# Altium project Thunderscope_Rev5.3.PrjPcb (part 2 of 3)

## Sheet FPGA_Bank_IO.SchDoc
size 297 x 209 mm
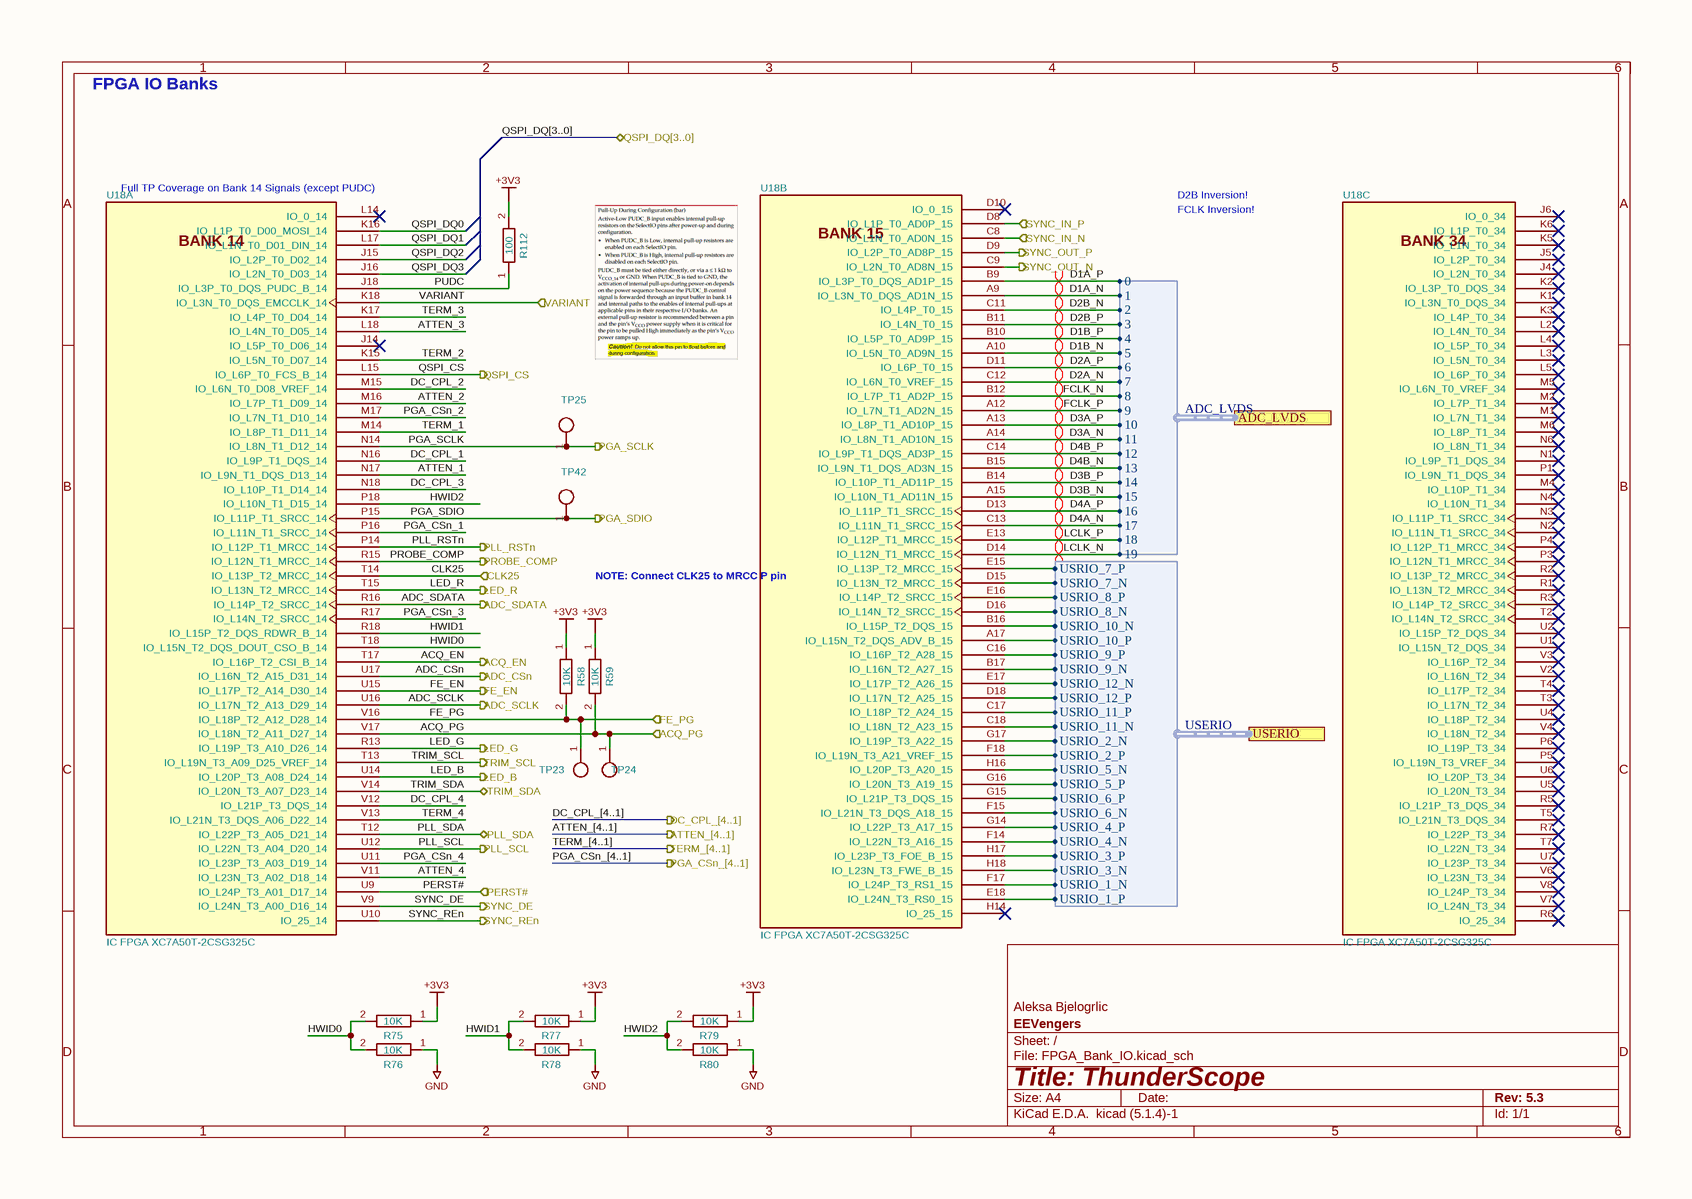
[diagram p5: FPGA_Bank_IO.SchDoc]

### Parts
R58  10K  [GEN_R_0402]
R59  10K  [GEN_R_0402]
R75  10K  [GEN_R_0402]
R76  10K  [GEN_R_0402]
R77  10K  [GEN_R_0402]
R78  10K  [GEN_R_0402]
R79  10K  [GEN_R_0402]
R80  10K  [GEN_R_0402]
R112  100  [GEN_R_0402]
TP23  PCB  [GEN_TP_PCB]  (value not drawn)
TP24  PCB  [GEN_TP_PCB]  (value not drawn)
TP25  PCB  [GEN_TP_PCB]  (value not drawn)
TP42  PCB  [GEN_TP_PCB]  (value not drawn)
U18  IC FPGA XC7A50T-2CSG325C  [XILINX_XC7A50T-2CSG325C]  (parts A,B,C of 9)

### Ports
ACQ_EN (out), ACQ_PG (in), ADC_CSn (out), ADC_LVDS (harness ADC_LVDS), ADC_SCLK (out), ADC_SDATA (out), ATTEN_[4..1] (out), CLK25 (in), DC_CPL_[4..1] (out), FE_EN (out), FE_PG (in), LED_B (out), LED_G (out), LED_R (out), PERST# (in), PGA_CSn_[4..1] (out), PGA_SCLK (out), PGA_SDIO (out), PLL_RSTn (out), PLL_SCL (out), PLL_SDA (bidir), PROBE_COMP (out), QSPI_CS (out), QSPI_DQ[3..0] (bidir), SYNC_DE (out), SYNC_IN_N (in), SYNC_IN_P (in), SYNC_OUT_N (out), SYNC_OUT_P (out), SYNC_REn (out), TERM_[4..1] (out), TRIM_SCL (out), TRIM_SDA (bidir), USERIO (harness USERIO), VARIANT (in)

### Harnesses
USERIO: USRIO_1_P, USRIO_1_N, USRIO_2_P, USRIO_2_N, USRIO_3_P, USRIO_3_N, USRIO_4_P, USRIO_4_N, USRIO_5_P, USRIO_5_N, USRIO_6_P, USRIO_6_N, USRIO_7_P, USRIO_7_N, USRIO_8_P, USRIO_8_N, USRIO_9_P, USRIO_9_N, USRIO_10_P, USRIO_10_N, USRIO_11_P, USRIO_11_N, USRIO_12_P, USRIO_12_N
ADC_LVDS: 0, 1, 2, 3, 4, 5, 6, 7, 8, 9, 10, 11, 12, 13, 14, 15, 16, 17, 18, 19

### Nets
+3V3: R58.1 R59.1 R75.1 R77.1 R79.1 R112.2
GND: R76.1 R78.1 R80.1
ACQ_EN: U18.T17(IO_L16P_T2_CSI_B_14) ; port ACQ_EN
ACQ_PG: R59.2 TP24.1 U18.V17(IO_L18N_T2_A11_D27_14) ; port ACQ_PG
ADC_CSn: U18.U17(IO_L16N_T2_A15_D31_14) ; port ADC_CSn
ADC_SCLK: U18.U16(IO_L17N_T2_A13_D29_14) ; port ADC_SCLK
ADC_SDATA: U18.R16(IO_L14P_T2_SRCC_14) ; port ADC_SDATA
ATTEN_1: U18.N17(IO_L9N_T1_DQS_D13_14)
ATTEN_2: U18.M16(IO_L7P_T1_D09_14)
ATTEN_3: U18.L18(IO_L4N_T0_D05_14)
ATTEN_4: U18.V11(IO_L23N_T3_A02_D18_14)
CLK25: U18.T14(IO_L13P_T2_MRCC_14) ; port CLK25
D1A_N: U18.A9(IO_L3N_T0_DQS_AD1N_15) ; port ADC_LVDS.1
D1A_P: U18.B9(IO_L3P_T0_DQS_AD1P_15) ; port ADC_LVDS.0
D1B_N: U18.A10(IO_L5N_T0_AD9N_15) ; port ADC_LVDS.5
D1B_P: U18.B10(IO_L5P_T0_AD9P_15) ; port ADC_LVDS.4
D2A_N: U18.C12(IO_L6N_T0_VREF_15) ; port ADC_LVDS.7
D2A_P: U18.D11(IO_L6P_T0_15) ; port ADC_LVDS.6
D2B_N: U18.C11(IO_L4P_T0_15) ; port ADC_LVDS.2
D2B_P: U18.B11(IO_L4N_T0_15) ; port ADC_LVDS.3
D3A_N: U18.A14(IO_L8N_T1_AD10N_15) ; port ADC_LVDS.11
D3A_P: U18.A13(IO_L8P_T1_AD10P_15) ; port ADC_LVDS.10
D3B_N: U18.A15(IO_L10N_T1_AD11N_15) ; port ADC_LVDS.15
D3B_P: U18.B14(IO_L10P_T1_AD11P_15) ; port ADC_LVDS.14
D4A_N: U18.C13(IO_L11N_T1_SRCC_15) ; port ADC_LVDS.17
D4A_P: U18.D13(IO_L11P_T1_SRCC_15) ; port ADC_LVDS.16
D4B_N: U18.B15(IO_L9N_T1_DQS_AD3N_15) ; port ADC_LVDS.13
D4B_P: U18.C14(IO_L9P_T1_DQS_AD3P_15) ; port ADC_LVDS.12
DC_CPL_1: U18.N16(IO_L9P_T1_DQS_14)
DC_CPL_2: U18.M15(IO_L6N_T0_D08_VREF_14)
DC_CPL_3: U18.N18(IO_L10P_T1_D14_14)
DC_CPL_4: U18.V12(IO_L21P_T3_DQS_14)
FCLK_N: U18.B12(IO_L7P_T1_AD2P_15) ; port ADC_LVDS.8
FCLK_P: U18.A12(IO_L7N_T1_AD2N_15) ; port ADC_LVDS.9
FE_EN: U18.U15(IO_L17P_T2_A14_D30_14) ; port FE_EN
FE_PG: R58.2 TP23.1 U18.V16(IO_L18P_T2_A12_D28_14) ; port FE_PG
HWID0: R75.2 R76.2 U18.T18(IO_L15N_T2_DQS_DOUT_CSO_B_14)
HWID1: R77.2 R78.2 U18.R18(IO_L15P_T2_DQS_RDWR_B_14)
HWID2: R79.2 R80.2 U18.P18(IO_L10N_T1_D15_14)
LCLK_N: U18.D14(IO_L12N_T1_MRCC_15) ; port ADC_LVDS.19
LCLK_P: U18.E13(IO_L12P_T1_MRCC_15) ; port ADC_LVDS.18
LED_B: U18.U14(IO_L20P_T3_A08_D24_14) ; port LED_B
LED_G: U18.R13(IO_L19P_T3_A10_D26_14) ; port LED_G
LED_R: U18.T15(IO_L13N_T2_MRCC_14) ; port LED_R
PERST#: U18.U9(IO_L24P_T3_A01_D17_14) ; port PERST#
PGA_CSn_1: U18.P16(IO_L11N_T1_SRCC_14)
PGA_CSn_2: U18.M17(IO_L7N_T1_D10_14)
PGA_CSn_3: U18.R17(IO_L14N_T2_SRCC_14)
PGA_CSn_4: U18.U11(IO_L23P_T3_A03_D19_14)
PGA_SCLK: TP25.1 U18.N14(IO_L8N_T1_D12_14) ; port PGA_SCLK
PGA_SDIO: TP42.1 U18.P15(IO_L11P_T1_SRCC_14) ; port PGA_SDIO
PLL_RSTn: U18.P14(IO_L12P_T1_MRCC_14) ; port PLL_RSTn
PLL_SCL: U18.U12(IO_L22N_T3_A04_D20_14) ; port PLL_SCL
PLL_SDA: U18.T12(IO_L22P_T3_A05_D21_14) ; port PLL_SDA
PROBE_COMP: U18.R15(IO_L12N_T1_MRCC_14) ; port PROBE_COMP
PUDC: R112.1 U18.J18(IO_L3P_T0_DQS_PUDC_B_14)
QSPI_CS: U18.L15(IO_L6P_T0_FCS_B_14) ; port QSPI_CS
QSPI_DQ0: U18.K16(IO_L1P_T0_D00_MOSI_14)
QSPI_DQ1: U18.L17(IO_L1N_T0_D01_DIN_14)
QSPI_DQ2: U18.J15(IO_L2P_T0_D02_14)
QSPI_DQ3: U18.J16(IO_L2N_T0_D03_14)
SYNC_DE: U18.V9(IO_L24N_T3_A00_D16_14) ; port SYNC_DE
SYNC_IN_N: U18.C8(IO_L1N_T0_AD0N_15) ; port SYNC_IN_N
SYNC_IN_P: U18.D8(IO_L1P_T0_AD0P_15) ; port SYNC_IN_P
SYNC_OUT_N: U18.C9(IO_L2N_T0_AD8N_15) ; port SYNC_OUT_N
SYNC_OUT_P: U18.D9(IO_L2P_T0_AD8P_15) ; port SYNC_OUT_P
SYNC_REn: U18.U10(IO_25_14) ; port SYNC_REn
TERM_1: U18.M14(IO_L8P_T1_D11_14)
TERM_2: U18.K15(IO_L5N_T0_D07_14)
TERM_3: U18.K17(IO_L4P_T0_D04_14)
TERM_4: U18.V13(IO_L21N_T3_DQS_A06_D22_14)
TRIM_SCL: U18.T13(IO_L19N_T3_A09_D25_VREF_14) ; port TRIM_SCL
TRIM_SDA: U18.V14(IO_L20N_T3_A07_D23_14) ; port TRIM_SDA
USERIO.USRIO_1_N: U18.F17(IO_L24P_T3_RS1_15) ; port USERIO.USRIO_1_N
USERIO.USRIO_1_P: U18.E18(IO_L24N_T3_RS0_15) ; port USERIO.USRIO_1_P
USERIO.USRIO_2_N: U18.G17(IO_L19P_T3_A22_15) ; port USERIO.USRIO_2_N
USERIO.USRIO_2_P: U18.F18(IO_L19N_T3_A21_VREF_15) ; port USERIO.USRIO_2_P
USERIO.USRIO_3_N: U18.H18(IO_L23N_T3_FWE_B_15) ; port USERIO.USRIO_3_N
USERIO.USRIO_3_P: U18.H17(IO_L23P_T3_FOE_B_15) ; port USERIO.USRIO_3_P
USERIO.USRIO_4_N: U18.F14(IO_L22N_T3_A16_15) ; port USERIO.USRIO_4_N
USERIO.USRIO_4_P: U18.G14(IO_L22P_T3_A17_15) ; port USERIO.USRIO_4_P
USERIO.USRIO_5_N: U18.H16(IO_L20P_T3_A20_15) ; port USERIO.USRIO_5_N
USERIO.USRIO_5_P: U18.G16(IO_L20N_T3_A19_15) ; port USERIO.USRIO_5_P
USERIO.USRIO_6_N: U18.F15(IO_L21N_T3_DQS_A18_15) ; port USERIO.USRIO_6_N
USERIO.USRIO_6_P: U18.G15(IO_L21P_T3_DQS_15) ; port USERIO.USRIO_6_P
USERIO.USRIO_7_N: U18.D15(IO_L13N_T2_MRCC_15) ; port USERIO.USRIO_7_N
USERIO.USRIO_7_P: U18.E15(IO_L13P_T2_MRCC_15) ; port USERIO.USRIO_7_P
USERIO.USRIO_8_N: U18.D16(IO_L14N_T2_SRCC_15) ; port USERIO.USRIO_8_N
USERIO.USRIO_8_P: U18.E16(IO_L14P_T2_SRCC_15) ; port USERIO.USRIO_8_P
USERIO.USRIO_9_N: U18.B17(IO_L16N_T2_A27_15) ; port USERIO.USRIO_9_N
USERIO.USRIO_9_P: U18.C16(IO_L16P_T2_A28_15) ; port USERIO.USRIO_9_P
USERIO.USRIO_10_N: U18.B16(IO_L15P_T2_DQS_15) ; port USERIO.USRIO_10_N
USERIO.USRIO_10_P: U18.A17(IO_L15N_T2_DQS_ADV_B_15) ; port USERIO.USRIO_10_P
USERIO.USRIO_11_N: U18.C18(IO_L18N_T2_A23_15) ; port USERIO.USRIO_11_N
USERIO.USRIO_11_P: U18.C17(IO_L18P_T2_A24_15) ; port USERIO.USRIO_11_P
USERIO.USRIO_12_N: U18.E17(IO_L17P_T2_A26_15) ; port USERIO.USRIO_12_N
USERIO.USRIO_12_P: U18.D18(IO_L17N_T2_A25_15) ; port USERIO.USRIO_12_P
VARIANT: U18.K18(IO_L3N_T0_DQS_EMCCLK_14) ; port VARIANT

Not connected (* = marked no-connect by the designer): U18 D10(IO_0_15)* H14(IO_25_15)* J4(IO_L2N_T0_34)* J5(IO_L2P_T0_34)* J6(IO_0_34)* J14(IO_L5P_T0_D06_14)* K1(IO_L3N_T0_DQS_34)* K2(IO_L3P_T0_DQS_34)* K3(IO_L4P_T0_34)* K5(IO_L1N_T0_34)* K6(IO_L1P_T0_34)* L2(IO_L4N_T0_34)* L3(IO_L5N_T0_34)* L4(IO_L5P_T0_34)* L5(IO_L6P_T0_34)* L14(IO_0_14)* M1(IO_L7N_T1_34)* M2(IO_L7P_T1_34)* M4(IO_L10P_T1_34)* M5(IO_L6N_T0_VREF_34)* M6(IO_L8P_T1_34)* N1(IO_L9P_T1_DQS_34)* N2(IO_L11N_T1_SRCC_34)* N3(IO_L11P_T1_SRCC_34)* N4(IO_L10N_T1_34)* N6(IO_L8N_T1_34)* P1(IO_L9N_T1_DQS_34)* P3(IO_L12N_T1_MRCC_34)* P4(IO_L12P_T1_MRCC_34)* P5(IO_L19N_T3_VREF_34)* P6(IO_L19P_T3_34)* R1(IO_L13N_T2_MRCC_34)* R2(IO_L13P_T2_MRCC_34)* R3(IO_L14P_T2_SRCC_34)* R5(IO_L21P_T3_DQS_34)* R6(IO_25_34)* R7(IO_L22P_T3_34)* T2(IO_L14N_T2_SRCC_34)* T3(IO_L17N_T2_34)* T4(IO_L17P_T2_34)* T5(IO_L21N_T3_DQS_34)* T7(IO_L22N_T3_34)* U1(IO_L15N_T2_DQS_34)* U2(IO_L15P_T2_DQS_34)* U4(IO_L18P_T2_34)* U5(IO_L20N_T3_34)* U6(IO_L20P_T3_34)* U7(IO_L23P_T3_34)* V2(IO_L16N_T2_34)* V3(IO_L16P_T2_34)* V4(IO_L18N_T2_34)* V6(IO_L23N_T3_34)* V7(IO_L24N_T3_34)* V8(IO_L24P_T3_34)*

### Buses and harness runs
bus ATTEN_[4..1] = port ATTEN_[4..1]
bus DC_CPL_[4..1] = port DC_CPL_[4..1]
bus PGA_CSn_[4..1] = port PGA_CSn_[4..1]
bus QSPI_DQ[3..0] = port QSPI_DQ[3..0]
bus TERM_[4..1] = port TERM_[4..1]

### Layout directives
differential pair; differential pair class 100Z_Diff: D1A_N, D1A_P, D1B_N, D1B_P, D2A_N, D2A_P, D2B_N, D2B_P, D3A_N, D3A_P, D3B_N, D3B_P, D4A_N, D4A_P, D4B_N, D4B_P, FCLK_N, FCLK_P, LCLK_N, LCLK_P

### Notes on the sheet
- FPGA IO Banks
- (near U18) Full TP Coverage on Bank 14 Signals (except PUDC)
- FCLK Inversion!
- D2B Inversion!
- NOTE: Connect CLK25 to MRCC P pin
- 1
- 2
- 3
- 4
- 5
- 6
- A
- B
- C
- Aleksa Bjelogrlic
- D
- Title: ThunderScope
- File: FPGA_Bank_IO.kicad_sch
- Sheet: /
- EEVengers
- KiCad E.D.A.  kicad (5.1.4)-1
- Size: A4
- Date:
- Rev: 5.3
- Id: 1/1
- (in symbol IC FPGA XC7A50T-2CSG325C, part A) BANK 14
- (in symbol IC FPGA XC7A50T-2CSG325C, part B) BANK 15
- (in symbol IC FPGA XC7A50T-2CSG325C, part C) BANK 34

### Library data of the parts
R58 R59 R75-R80 = RES 10K OHM 1% 1/16W 0402: as R1029_4 on sheet FE_Channel; PACKAGE: 0402; SUPPLIER 1: Mouser; SUPPLIER PART NUMBER 1: 603-RC0402FR-0710KL; Footprint: Thunderscope_Rev5:GEN_R_0402; Value: 10K
R112 = RES 100 OHM 1% 1/10W 0402: as R60 on sheet FPGA; PACKAGE: 0402; SUPPLIER 1: Mouser; SUPPLIER PART NUMBER 1: 603-RC0402FR-07100RL; Footprint: Thunderscope_Rev5:GEN_R_0402; Value: 100
TP23-TP25 TP42 = TP PCB 1mm: Footprint: Thunderscope_Rev5:GEN_TP_PCB; Value: PCB
U18 = IC FPGA XC7A50T-2CSG325C: as U18 on sheet FPGA_PWR; HOUSE PART NUMBER: XC7A50T-2CSG325C; MANUFACTURER PART NUMBER: XC7A50T-2CSG325C; SUPPLIER 1: Digi-Key; SUPPLIER PART NUMBER 1: 122-2193-ND; PACKAGE: 324-BGA (15x15mm); Value: IC FPGA XC7A50T-2CSG325C; Footprint: Thunderscope_Rev5:XILINX_XC7A50T-2CSG325C

## Sheet FPGA_VREG.SchDoc
size 297 x 209 mm
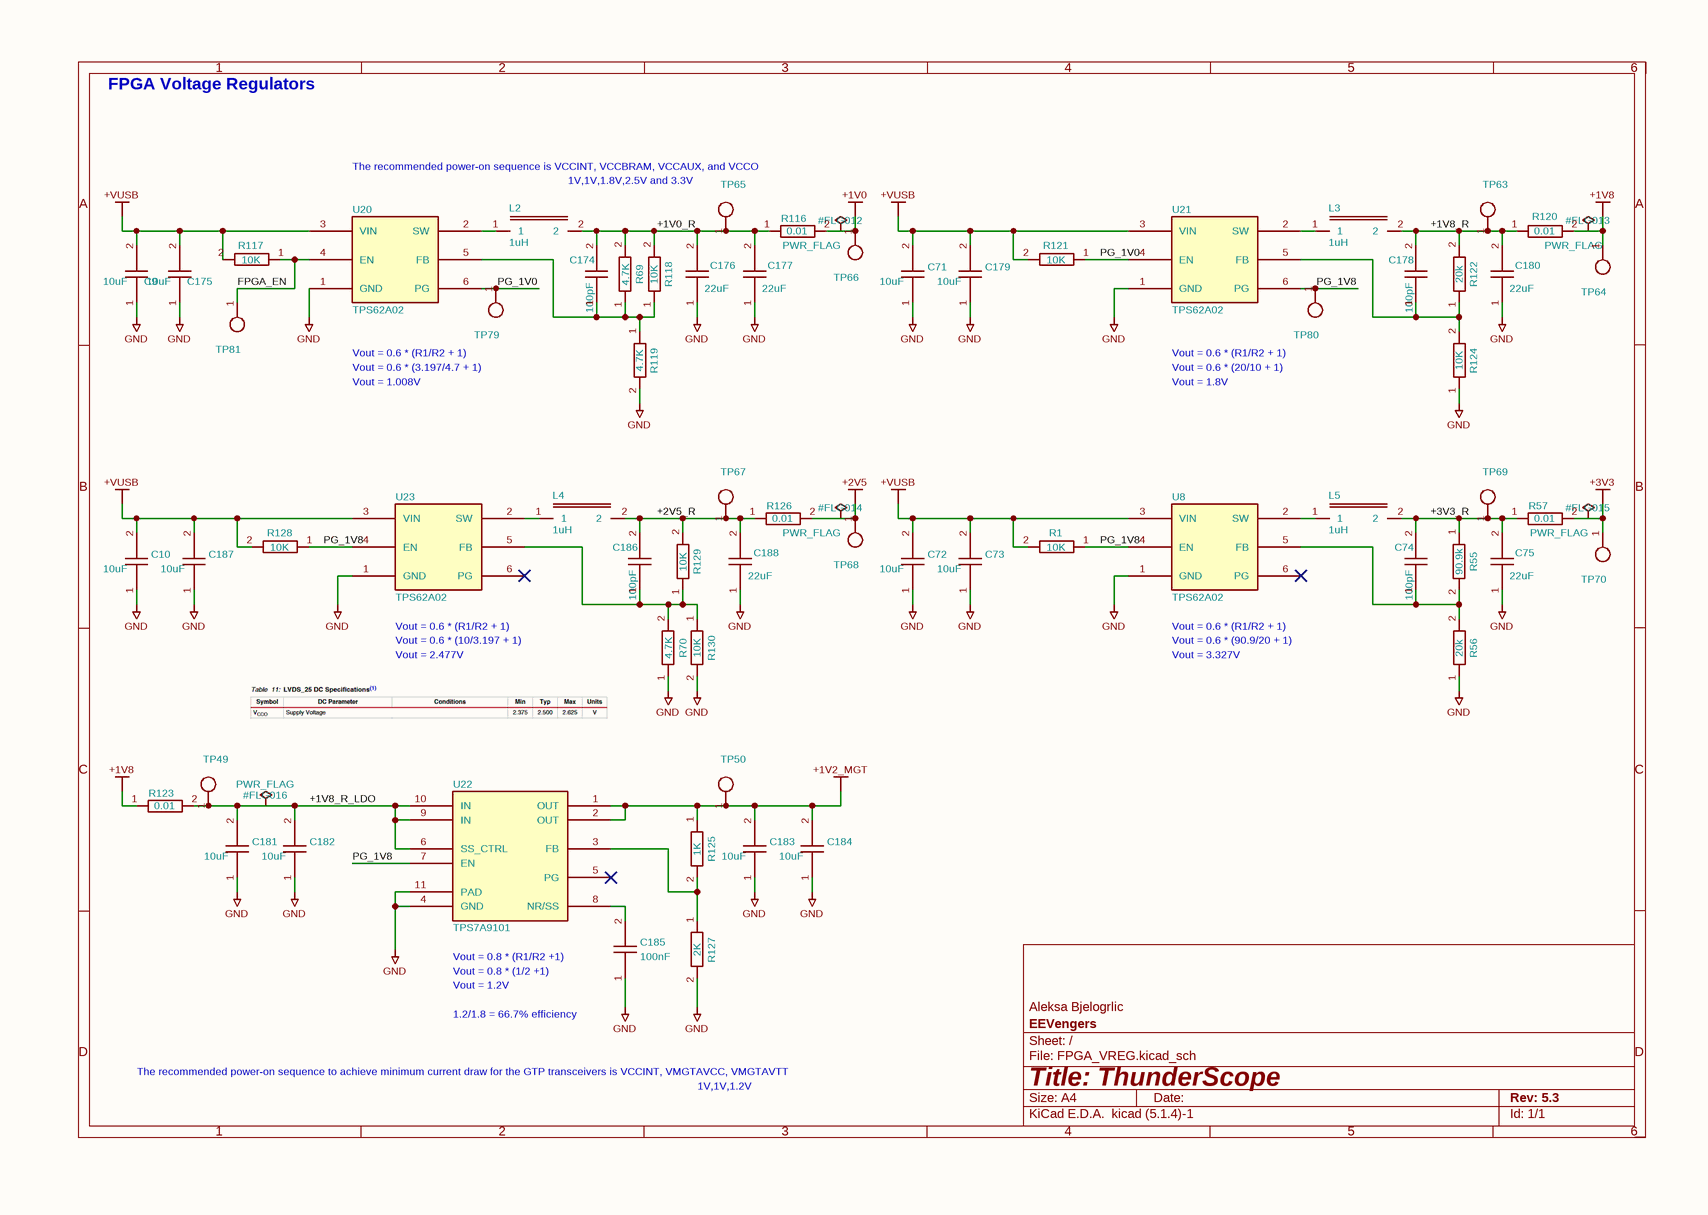
[diagram p6: FPGA_VREG.SchDoc]

### Parts
#FLG012  PWR_FLAG  (graphical)
#FLG013  PWR_FLAG  (graphical)
#FLG014  PWR_FLAG  (graphical)
#FLG015  PWR_FLAG  (graphical)
#FLG016  PWR_FLAG  (graphical)
C9  10uF  [GEN_C_0603]
C10  10uF  [GEN_C_0603]
C71  10uF  [GEN_C_0603]
C72  10uF  [GEN_C_0603]
C73  10uF  [GEN_C_0603]
C74  100pF  [GEN_C_0402]
C75  22uF  [GEN_C_0805]
C174  100pF  [GEN_C_0402]
C175  10uF  [GEN_C_0603]
C176  22uF  [GEN_C_0805]
C177  22uF  [GEN_C_0805]
C178  100pF  [GEN_C_0402]
C179  10uF  [GEN_C_0603]
C180  22uF  [GEN_C_0805]
C181  10uF  [GEN_C_0603]
C182  10uF  [GEN_C_0603]
C183  10uF  [GEN_C_0603]
C184  10uF  [GEN_C_0603]
C185  100nF  [GEN_C_0402]
C186  100pF  [GEN_C_0402]
C187  10uF  [GEN_C_0603]
C188  22uF  [GEN_C_0805]
L2  1uH  [GEN_L_1210]
L3  1uH  [GEN_L_1210]
L4  1uH  [GEN_L_1210]
L5  1uH  [GEN_L_1210]
R1  10K  [GEN_R_0402]
R55  90.9k  [GEN_R_0402]
R56  20k  [GEN_R_0402]
R57  0.01  [GEN_R_0603]
R69  4.7K  [GEN_R_0402]
R70  4.7K  [GEN_R_0402]
R116  0.01  [GEN_R_0603]
R117  10K  [GEN_R_0402]
R118  10K  [GEN_R_0402]
R119  4.7K  [GEN_R_0402]
R120  0.01  [GEN_R_0603]
R121  10K  [GEN_R_0402]
R122  20k  [GEN_R_0402]
R123  0.01  [GEN_R_0603]
R124  10K  [GEN_R_0402]
R125  1K  [GEN_R_0402]
R126  0.01  [GEN_R_0603]
R127  2K  [GEN_R_0402]
R128  10K  [GEN_R_0402]
R129  10K  [GEN_R_0402]
R130  10K  [GEN_R_0402]
TP49  PCB  [GEN_TP_PCB]  (value not drawn)
TP50  PCB  [GEN_TP_PCB]  (value not drawn)
TP63  PCB  [GEN_TP_PCB]  (value not drawn)
TP64  PCB  [GEN_TP_PCB]  (value not drawn)
TP65  PCB  [GEN_TP_PCB]  (value not drawn)
TP66  PCB  [GEN_TP_PCB]  (value not drawn)
TP67  PCB  [GEN_TP_PCB]  (value not drawn)
TP68  PCB  [GEN_TP_PCB]  (value not drawn)
TP69  PCB  [GEN_TP_PCB]  (value not drawn)
TP70  PCB  [GEN_TP_PCB]  (value not drawn)
TP79  PCB  [GEN_TP_PCB]  (value not drawn)
TP80  PCB  [GEN_TP_PCB]  (value not drawn)
TP81  PCB  [GEN_TP_PCB]  (value not drawn)
U8  TPS62A02  [TI_SOT563_DRL0006A]
U20  TPS62A02  [TI_SOT563_DRL0006A]
U21  TPS62A02  [TI_SOT563_DRL0006A]
U22  TPS7A9101  [TI_WSON10_DSK0010A]
U23  TPS62A02  [TI_SOT563_DRL0006A]

### Nets
+1V0: #FLG012.1 R116.2 TP66.1
+1V2_MGT: C183.2 C184.2 R125.1 TP50.1 U22.1(OUT) U22.2(OUT)
+1V8: #FLG013.1 R120.2 R123.1 TP64.1
+2V5: #FLG014.1 R126.2 TP68.1
+3V3: #FLG015.1 R57.2 TP70.1
+VUSB: C9.2 C10.2 C71.2 C72.2 C73.2 C175.2 C179.2 C187.2 R1.2 R117.2 R121.2 R128.2 U8.3(VIN) U20.3(VIN) U21.3(VIN) U23.3(VIN)
GND: C9.1 C10.1 C71.1 C72.1 C73.1 C75.1 C175.1 C176.1 C177.1 C179.1 C180.1 C181.1 C182.1 C183.1 C184.1 C185.1 C187.1 C188.1 R56.1 R70.1 R119.2 R124.1 R127.2 R130.2 U8.1(GND) U20.1(GND) U21.1(GND) U22.4(GND) U22.11(PAD) U23.1(GND)
+1V0_R: C174.2 C176.2 C177.2 L2.2 R69.2 R116.1 R118.2 TP65.1
+1V8_R: C178.2 C180.2 L3.2 R120.1 R122.2 TP63.1
+1V8_R_LDO: #FLG016.1 C181.2 C182.2 R123.2 TP49.1 U22.6(SS_CTRL) U22.9(IN) U22.10(IN)
+2V5_R: C186.2 C188.2 L4.2 R126.1 R129.2 TP67.1
+3V3_R: C74.2 C75.2 L5.2 R55.1 R57.1 TP69.1
FPGA_EN: R117.1 TP81.1 U20.4(EN)
PG_1V0: R121.1 TP79.1 U20.6(PG) U21.4(EN)
PG_1V8: R1.1 R128.1 TP80.1 U8.4(EN) U21.6(PG) U22.7(EN) U23.4(EN)
NetC74_1: C74.1 R55.2 R56.2 U8.5(FB)
NetC174_1: C174.1 R69.1 R118.1 R119.1 U20.5(FB)
NetC178_1: C178.1 R122.1 R124.2 U21.5(FB)
NetC185_2: C185.2 U22.8(NR/SS)
NetC186_1: C186.1 R70.2 R129.1 R130.1 U23.5(FB)
NetL2_1: L2.1 U20.2(SW)
NetL3_1: L3.1 U21.2(SW)
NetL4_1: L4.1 U23.2(SW)
NetL5_1: L5.1 U8.2(SW)
NetR125_2: R125.2 R127.1 U22.3(FB)

Not connected (* = marked no-connect by the designer): U8 6(PG)*; U22 5(PG)*; U23 6(PG)*

### Notes on the sheet
- FPGA Voltage Regulators
- The recommended power-on sequence is VCCINT, VCCBRAM, VCCAUX, and VCCO
- 1V,1V,1.8V,2.5V and 3.3V
- Vout = 0.6 * (R1/R2 + 1)
- Vout = 1.008V
- Vout = 0.6 * (3.197/4.7 + 1)
- Vout = 1.8V
- Vout = 0.6 * (20/10 + 1)
- (near U23) Vout = 0.6 * (R1/R2 + 1)
- Vout = 0.6 * (10/3.197 + 1)
- Vout = 0.6 * (90.9/20 + 1)
- (near U8) Vout = 0.6 * (R1/R2 + 1)
- Vout = 2.477V
- Vout = 3.327V
- Vout = 0.8 * (1/2 +1)
- Vout = 1.2V
- Vout = 0.8 * (R1/R2 +1)
- The recommended power-on sequence to achieve minimum current draw for the GTP transceivers is VCCINT, VMGTAVCC, VMGTAVTT
- 1.2/1.8 = 66.7% efficiency
- 1V,1V,1.2V
- 1
- 2
- 3
- 4
- 5
- 6
- A
- B
- C
- Aleksa Bjelogrlic
- D
- Title: ThunderScope
- File: FPGA_VREG.kicad_sch
- Sheet: /
- EEVengers
- KiCad E.D.A.  kicad (5.1.4)-1
- Size: A4
- Date:
- Rev: 5.3
- Id: 1/1

### Library data of the parts
C9 C10 C71-C73 C175 C179 C181-C184 C187 = CAP 10uF 25V X5R 0603: MANUFACTURER: Murata; MANUFACTURER PART NUMBER: GRM188R61E106MA73D; VOLTAGE RATING: 25V; Substitutions Policy: Any Parametric Equivalent; PACKAGE: 0402; SUPPLIER 1: Mouser; SUPPLIER PART NUMBER 1: 81-GRM188R61E106MA3D; Footprint: Thunderscope_Rev5:GEN_C_0603; Value: 10uF
C74 C174 C178 C186 = CAP 100pF 50V C0G 0402: MANUFACTURER: Murata; MANUFACTURER PART NUMBER: GCM1555C1H101FA16D; TEMPERATURE COEFFICIENT: C0G; VOLTAGE RATING: 50V; Substitutions Policy: Any Parametric Equivalent; PACKAGE: 0402; SUPPLIER 1: Mouser; SUPPLIER PART NUMBER 1: 81-GCM1555C1H101FA6D; Footprint: Thunderscope_Rev5:GEN_C_0402; Value: 100pF
C75 C176 C177 C180 C188 = CAP 22uF 25V X5R 0805: HOUSE PART NUMBER: C-22uF-0805-002; MANUFACTURER: Murata; MANUFACTURER PART NUMBER: GRM21BR61E226ME44L; VOLTAGE RATING: 25V; Substitutions Policy: Any Parametric Equivalent; PACKAGE: 0805; SUPPLIER 1: Mouser; SUPPLIER PART NUMBER 1: 81-GRM21BR61E226ME4L; Footprint: Thunderscope_Rev5:GEN_C_0805; Value: 22uF
C185 = CAP 100nF 16V X7R 0402: HOUSE PART NUMBER: C-100nF-0402-002; MANUFACTURER: Murata; MANUFACTURER PART NUMBER: GCM155R71C104KA55D; VOLTAGE RATING: 16V; Substitutions Policy: Any Parametric Equivalent; PACKAGE: 0402; SUPPLIER 1: Mouser; SUPPLIER PART NUMBER 1: 81-GCM155R71C104KA5D; Footprint: Thunderscope_Rev5:GEN_C_0402; Value: 100nF
L2-L5 = IND 1uH 5.5A 32 MOHM 1210: HOUSE PART NUMBER: SRP3212-1R0M; MANUFACTURER: Bourns; Substitutions Policy: ECO Required for Substitution; SUPPLIER 1: Mouser; SUPPLIER PART NUMBER 1: 652-SRP3212-1R0M; MANUFACTURER PART NUMBER: SRP3212-1R0M; PACKAGE: 1210; Value: 1uH; Footprint: Thunderscope_Rev5:GEN_L_1210
R1 R117 R118 R121 R124 R128-R130 = RES 10K OHM 1% 1/16W 0402: MANUFACTURER: Yageo; MANUFACTURER PART NUMBER: RC0402FR-0710KL; TOLERANCE: 1%; Substitutions Policy: Any Parametric Equivalent; PACKAGE: 0402; SUPPLIER 1: Mouser; SUPPLIER PART NUMBER 1: 603-RC0402FR-0710KL; Footprint: Thunderscope_Rev5:GEN_R_0402; Value: 10K
R55 = RES 90.9K OHM 1% 1/16W 0402: MANUFACTURER: Yageo; MANUFACTURER PART NUMBER: RC0402FR-0790K9L; TOLERANCE: 1%; Substitutions Policy: Any Parametric Equivalent; PACKAGE: 0402; SUPPLIER 1: Mouser; SUPPLIER PART NUMBER 1: 603-RC0402FR-0790K9L; Footprint: Thunderscope_Rev5:GEN_R_0402; Value: 90.9k
R56 R122 = RES 20K OHM 1% 1/16W 0402: MANUFACTURER: Yageo; MANUFACTURER PART NUMBER: RC0402FR-0720KL; TOLERANCE: 1%; Substitutions Policy: Any Parametric Equivalent; PACKAGE: 0402; SUPPLIER 1: Mouser; SUPPLIER PART NUMBER 1: 603-RC0402FR-0720KL; Footprint: Thunderscope_Rev5:GEN_R_0402; Value: 20k
R57 R116 R120 R123 R126 = RES 0.01 OHM 1% 1/4W 0603: HOUSE PART NUMBER: R-0.01-0603-1%-001; MANUFACTURER: Susumu; MANUFACTURER PART NUMBER: RL0816T-R010-F; TOLERANCE: 1%; Substitutions Policy: Any Parametric Equivalent; SUPPLIER 1: Mouser; SUPPLIER PART NUMBER 1: 754-RL0816T-R010-F; PACKAGE: 0603; Footprint: Thunderscope_Rev5:GEN_R_0603; Value: 0.01
R69 R70 R119 = RES 4.7K OHM 1% 1/16W 0402: MANUFACTURER: Yageo; MANUFACTURER PART NUMBER: RC0402FR-074K7L; TOLERANCE: 1%; Substitutions Policy: Any Parametric Equivalent; PACKAGE: 0402; SUPPLIER 1: Mouser; SUPPLIER PART NUMBER 1: 603-RC0402FR-074K7L; Footprint: Thunderscope_Rev5:GEN_R_0402; Value: 4.7K
R125 = RES 1K OHM 1% 1/10W 0402: HOUSE PART NUMBER: R-1K-0402-1%-001; MANUFACTURER: Yageo; MANUFACTURER PART NUMBER: RC0402FR-071KL; TOLERANCE: 1%; Substitutions Policy: Any Parametric Equivalent; PACKAGE: 0402; SUPPLIER 1: Mouser; SUPPLIER PART NUMBER 1: 603-RC0402FR-071KL; Footprint: Thunderscope_Rev5:GEN_R_0402; Value: 1K
R127 = RES 2K OHM 1% 1/16W 0402: MANUFACTURER: Yageo; MANUFACTURER PART NUMBER: RC0402FR-072KL; TOLERANCE: 1%; Substitutions Policy: Any Parametric Equivalent; PACKAGE: 0402; SUPPLIER 1: Mouser; SUPPLIER PART NUMBER 1: 603-RC0402FR-072KL; Footprint: Thunderscope_Rev5:GEN_R_0402; Value: 2K
TP49 TP50 TP63-TP70 TP79-TP81 = TP PCB 1mm: Footprint: Thunderscope_Rev5:GEN_TP_PCB; Value: PCB
U8 U20 U21 U23 = IC BUCK TPS62A02: HOUSE PART NUMBER: TPS62A02DRLR; MANUFACTURER: Texas Instruments; Substitutions Policy: No Substitutions; SUPPLIER 1: Texas Instruments; SUPPLIER PART NUMBER 1: TPS62A02DRLR; MANUFACTURER PART NUMBER: TPS62A02DRLR; PACKAGE: SOT-563; Footprint: Thunderscope_Rev5:TI_SOT563_DRL0006A; Value: TPS62A02
U22 = IC LDO TPS7A9101: MANUFACTURER: Texas Instruments; MANUFACTURER PART NUMBER: TPS7A9101DSKR; Substitutions Policy: No Substitutions; SUPPLIER 1: Texas Instruments; SUPPLIER PART NUMBER 1: TPS7A9101DSKR; PACKAGE: 10-DFN (2.5x2.5mm); Value: TPS7A9101; Footprint: Thunderscope_Rev5:TI_WSON10_DSK0010A
#FLG012 #FLG013 #FLG014 #FLG015 #FLG016 = PWR_FLAG: Value: PWR_FLAG

## Sheet FPGA_CFG_MGT.SchDoc
size 297 x 209 mm
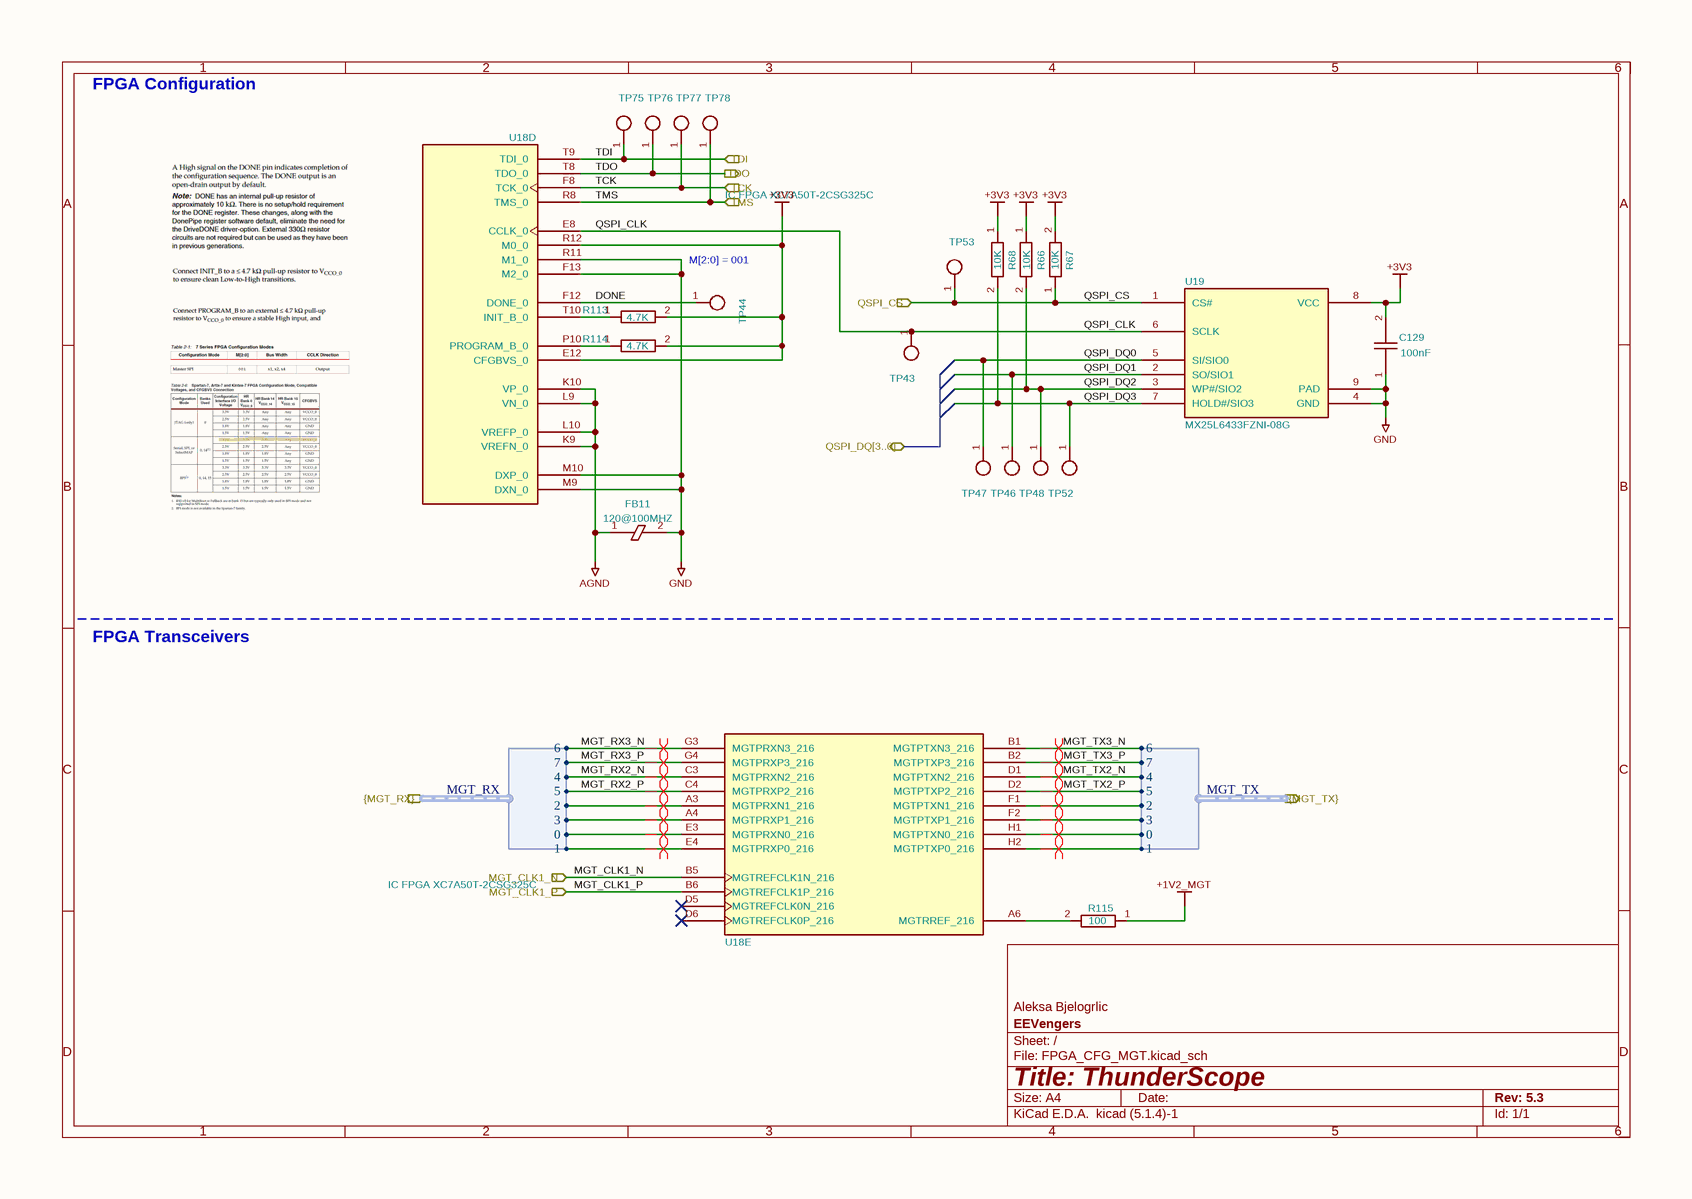
[diagram p7: FPGA_CFG_MGT.SchDoc]

### Parts
C129  100nF  [GEN_C_0402]
FB11  120@100MHZ  [GEN_R_0402]
R66  10K  [GEN_R_0402]
R67  10K  [GEN_R_0402]
R68  10K  [GEN_R_0402]
R113  4.7K  [GEN_R_0402]
R114  4.7K  [GEN_R_0402]
R115  100  [GEN_R_0402]
TP43  PCB  [GEN_TP_PCB]  (value not drawn)
TP44  PCB  [GEN_TP_PCB]  (value not drawn)
TP46  PCB  [GEN_TP_PCB]  (value not drawn)
TP47  PCB  [GEN_TP_PCB]  (value not drawn)
TP48  PCB  [GEN_TP_PCB]  (value not drawn)
TP52  PCB  [GEN_TP_PCB]  (value not drawn)
TP53  PCB  [GEN_TP_PCB]  (value not drawn)
TP75  PCB  [GEN_TP_PCB]  (value not drawn)
TP76  PCB  [GEN_TP_PCB]  (value not drawn)
TP77  PCB  [GEN_TP_PCB]  (value not drawn)
TP78  PCB  [GEN_TP_PCB]  (value not drawn)
U18  IC FPGA XC7A50T-2CSG325C  [XILINX_XC7A50T-2CSG325C]  (parts D,E of 9)
U19  MX25L6433FZNI-08G  [MX_WSON8]

### Ports
MGT_CLK1_N (in), MGT_CLK1_P (in), QSPI_CS (in), QSPI_DQ[3..0] (bidir), TCK (in), TDI (in), TDO (out), TMS (in), {MGT_RX} (in, harness MGT_RX), {MGT_TX} (out, harness MGT_TX)

### Harnesses
MGT_TX: 0, 1, 2, 3, 4, 5, 6, 7
MGT_RX: 0, 1, 2, 3, 4, 5, 6, 7

### Nets
+1V2_MGT: R115.1
+3V3: C129.2 R66.1 R67.2 R68.1 R113.2 R114.2 U18.E12(CFGBVS_0) U18.R12(M0_0) U19.8(VCC)
AGND: FB11.1 U18.K9(VREFN_0) U18.K10(VP_0) U18.L9(VN_0) U18.L10(VREFP_0)
GND: C129.1 FB11.2 U18.F13(M2_0) U18.M9(DXN_0) U18.M10(DXP_0) U18.R11(M1_0) U19.4(GND) U19.9(PAD)
DONE: TP44.1 U18.F12(DONE_0)
MGT_CLK1_N: U18.B5(MGTREFCLK1N_216) ; port MGT_CLK1_N
MGT_CLK1_P: U18.B6(MGTREFCLK1P_216) ; port MGT_CLK1_P
MGT_RX0_N: U18.E3(MGTPRXN0_216) ; port {MGT_RX}.0
MGT_RX0_P: U18.E4(MGTPRXP0_216) ; port {MGT_RX}.1
MGT_RX1_N: U18.A3(MGTPRXN1_216) ; port {MGT_RX}.2
MGT_RX1_P: U18.A4(MGTPRXP1_216) ; port {MGT_RX}.3
MGT_RX2_N: U18.C3(MGTPRXN2_216) ; port {MGT_RX}.4
MGT_RX2_P: U18.C4(MGTPRXP2_216) ; port {MGT_RX}.5
MGT_RX3_N: U18.G3(MGTPRXN3_216) ; port {MGT_RX}.6
MGT_RX3_P: U18.G4(MGTPRXP3_216) ; port {MGT_RX}.7
MGT_TX0_N: U18.H1(MGTPTXN0_216) ; port {MGT_TX}.0
MGT_TX0_P: U18.H2(MGTPTXP0_216) ; port {MGT_TX}.1
MGT_TX1_N: U18.F1(MGTPTXN1_216) ; port {MGT_TX}.2
MGT_TX1_P: U18.F2(MGTPTXP1_216) ; port {MGT_TX}.3
MGT_TX2_N: U18.D1(MGTPTXN2_216) ; port {MGT_TX}.4
MGT_TX2_P: U18.D2(MGTPTXP2_216) ; port {MGT_TX}.5
MGT_TX3_N: U18.B1(MGTPTXN3_216) ; port {MGT_TX}.6
MGT_TX3_P: U18.B2(MGTPTXP3_216) ; port {MGT_TX}.7
QSPI_CLK: TP43.1 U18.E8(CCLK_0) U19.6(SCLK)
QSPI_CS: R67.1 TP53.1 U19.1(CS#) ; port QSPI_CS
QSPI_DQ0: TP47.1 U19.5(SI/SIO0)
QSPI_DQ1: TP46.1 U19.2(SO/SIO1)
QSPI_DQ2: R66.2 TP48.1 U19.3(WP#/SIO2)
QSPI_DQ3: R68.2 TP52.1 U19.7(HOLD#/SIO3)
TCK: TP77.1 U18.F8(TCK_0) ; port TCK
TDI: TP75.1 U18.T9(TDI_0) ; port TDI
TDO: TP76.1 U18.T8(TDO_0) ; port TDO
TMS: TP78.1 U18.R8(TMS_0) ; port TMS
NetR113_1: R113.1 U18.T10(INIT_B_0)
NetR114_1: R114.1 U18.P10(PROGRAM_B_0)
NetR115_2: R115.2 U18.A6(MGTRREF_216)

Not connected (* = marked no-connect by the designer): U18 D5(MGTREFCLK0N_216)* D6(MGTREFCLK0P_216)*

### Layout directives
differential pair; differential pair class PCIe: MGT_RX0_N, MGT_RX0_P, MGT_RX1_N, MGT_RX1_P, MGT_RX2_N, MGT_RX2_P, MGT_RX3_N, MGT_RX3_P, MGT_TX0_N, MGT_TX0_P, MGT_TX1_N, MGT_TX1_P, MGT_TX2_N, MGT_TX2_P, MGT_TX3_N, MGT_TX3_P

### Notes on the sheet
- FPGA Configuration
- (near TP44) M[2:0] = 001
- FPGA Transceivers
- 1
- 2
- 3
- 4
- 5
- 6
- A
- B
- C
- Aleksa Bjelogrlic
- D
- Title: ThunderScope
- File: FPGA_CFG_MGT.kicad_sch
- Sheet: /
- EEVengers
- KiCad E.D.A.  kicad (5.1.4)-1
- Size: A4
- Date:
- Rev: 5.3
- Id: 1/1

### Library data of the parts
C129 = CAP 100nF 16V X7R 0402: as C185 on sheet FPGA_VREG; PACKAGE: 0402; SUPPLIER 1: Mouser; SUPPLIER PART NUMBER 1: 81-GCM155R71C104KA5D; Footprint: Thunderscope_Rev5:GEN_C_0402; Value: 100nF
FB11 = FERRITE BEAD 120 OHM 0402: HOUSE PART NUMBER: BLM15PX121SN1D; MANUFACTURER: Murata; Substitutions Policy: No Substitutions; SUPPLIER 1: Mouser; SUPPLIER PART NUMBER 1: 81-BLM15PX121SN1D; MANUFACTURER PART NUMBER: BLM15PX121SN1D; PACKAGE: 0402; Footprint: Thunderscope_Rev5:GEN_R_0402; Value: 120@100MHZ
R66-R68 = RES 10K OHM 1% 1/16W 0402: as R1 on sheet FPGA_VREG; PACKAGE: 0402; SUPPLIER 1: Mouser; SUPPLIER PART NUMBER 1: 603-RC0402FR-0710KL; Footprint: Thunderscope_Rev5:GEN_R_0402; Value: 10K
R113 R114 = RES 4.7K OHM 1% 1/16W 0402: as R69 on sheet FPGA_VREG; PACKAGE: 0402; SUPPLIER 1: Mouser; SUPPLIER PART NUMBER 1: 603-RC0402FR-074K7L; Footprint: Thunderscope_Rev5:GEN_R_0402; Value: 4.7K
R115 = RES 100 OHM 1% 1/10W 0402: MANUFACTURER: Yageo; MANUFACTURER PART NUMBER: RC0402FR-07100RL; TOLERANCE: 1%; Substitutions Policy: Any Parametric Equivalent; PACKAGE: 0402; SUPPLIER 1: Mouser; SUPPLIER PART NUMBER 1: 603-RC0402FR-07100RL; Footprint: Thunderscope_Rev5:GEN_R_0402; Value: 100
TP43 TP44 TP46-TP48 TP52 TP53 TP75-TP78 = TP PCB 1mm: Footprint: Thunderscope_Rev5:GEN_TP_PCB; Value: PCB
U18 = IC FPGA XC7A50T-2CSG325C: MANUFACTURER: Xilinx; Substitutions Policy: No Substitutions; HOUSE PART NUMBER: XC7A50T-2CSG325C; MANUFACTURER PART NUMBER: XC7A50T-2CSG325C; SUPPLIER 1: Digi-Key; SUPPLIER PART NUMBER 1: 122-2193-ND; PACKAGE: 324-BGA (15x15mm); Value: IC FPGA XC7A50T-2CSG325C; Footprint: Thunderscope_Rev5:XILINX_XC7A50T-2CSG325C
U19 = IC FLASH MX25L6433FZNI-08G: HOUSE PART NUMBER: MX25L6433FZNI-08G-TR; MANUFACTURER: Macronix; Substitutions Policy: ECO Required for Substitution; SUPPLIER 1: Mouser; SUPPLIER PART NUMBER 1: 95-25L6433FZNI08TR; MANUFACTURER PART NUMBER: MX25L6433FZNI-08G-TR; PACKAGE: 8-WSON (6x5mm); Value: MX25L6433FZNI-08G; Footprint: Thunderscope_Rev5:MX_WSON8

## Sheet M2_KEY_M.SchDoc
size 297 x 209 mm
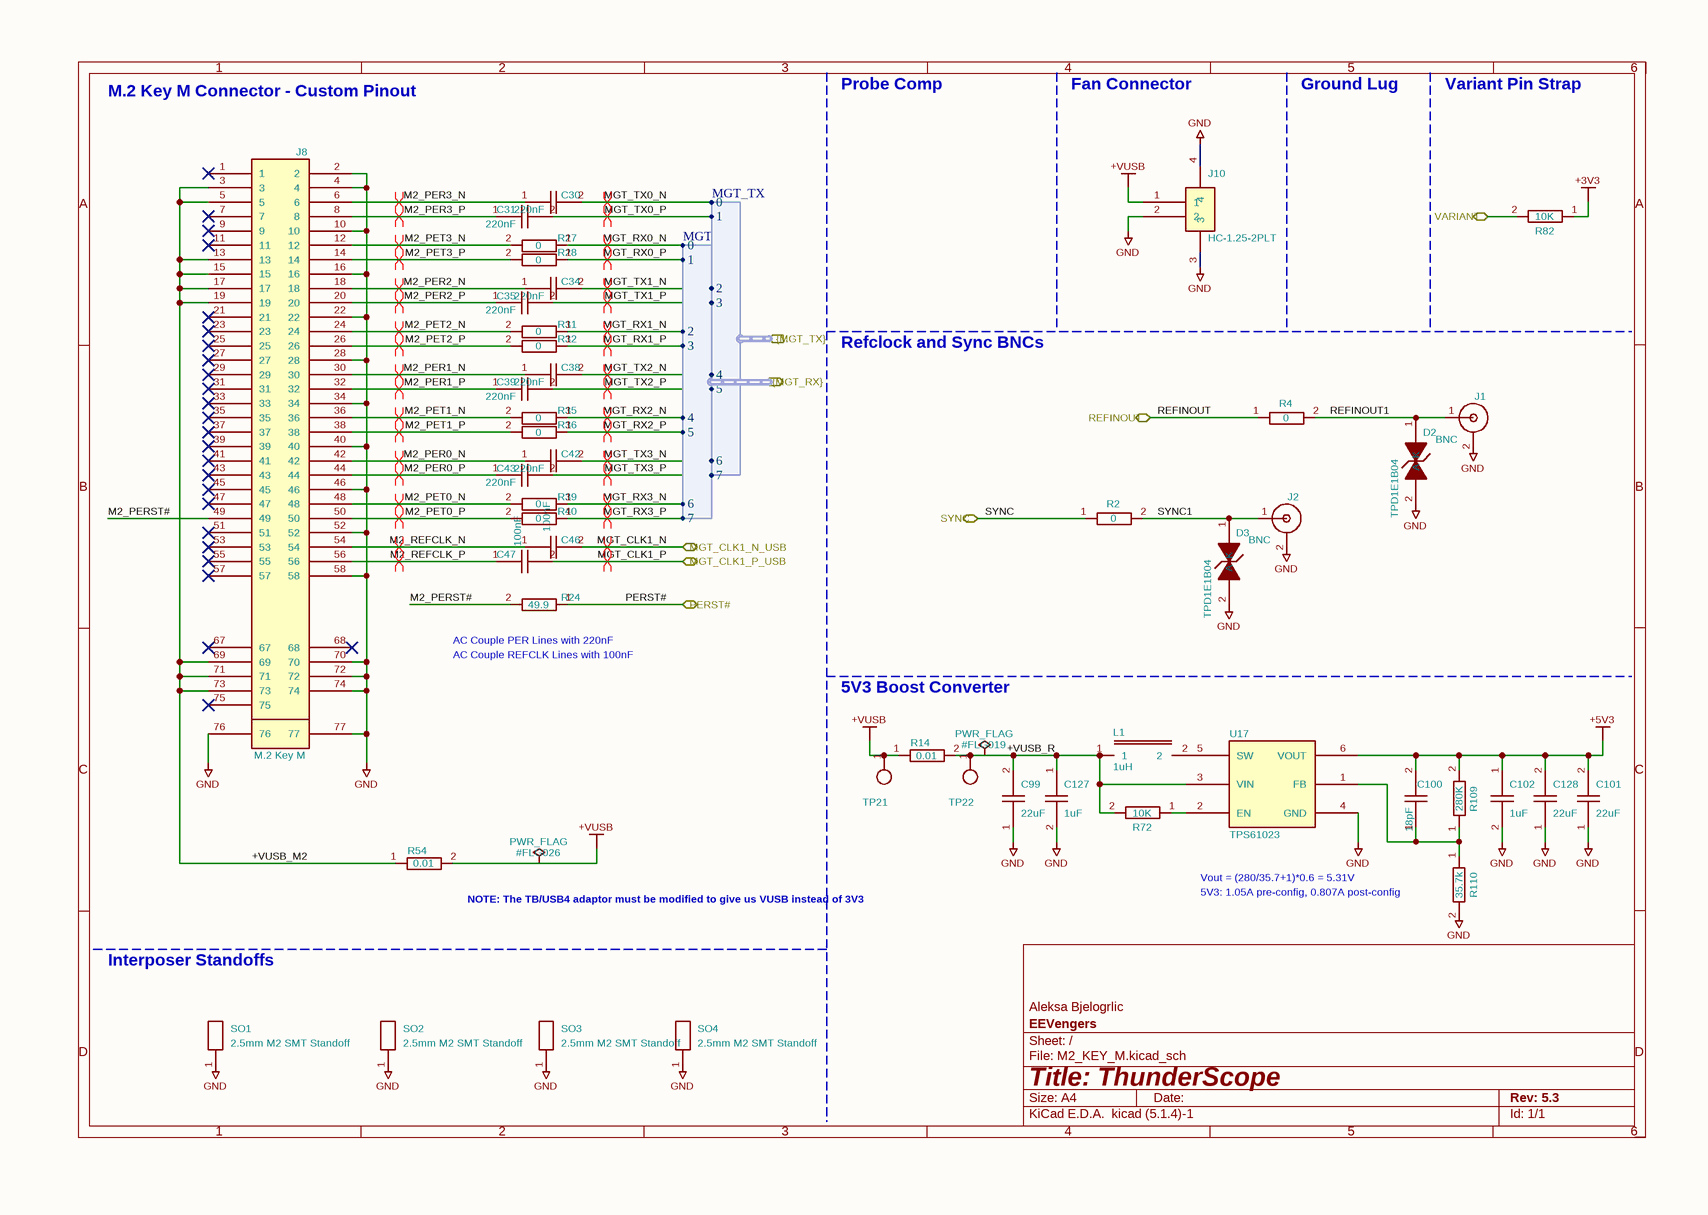
[diagram p8: M2_KEY_M.SchDoc]

### Parts
#FLG019  PWR_FLAG  (graphical)
#FLG026  PWR_FLAG  (graphical)
C30  220nF  [GEN_C_0402]
C31  220nF  [GEN_C_0402]
C34  220nF  [GEN_C_0402]
C35  220nF  [GEN_C_0402]
C38  220nF  [GEN_C_0402]
C39  220nF  [GEN_C_0402]
C42  220nF  [GEN_C_0402]
C43  220nF  [GEN_C_0402]
C46  100nF  [GEN_C_0402]
C47  100nF  [GEN_C_0402]
C99  22uF  [GEN_C_0805]
C100  18pF  [GEN_C_0402]
C101  22uF  [GEN_C_0805]
C102  1uF  [GEN_C_0402]
C127  1uF  [GEN_C_0402]
C128  22uF  [GEN_C_0805]
D2  TPD1E1B04  [TI_X1SON_DPY0002A]
D3  TPD1E1B04  [TI_X1SON_DPY0002A]
J1  BNC  [DOSIN-801-0072]
J2  BNC  [DOSIN-801-0072]
J8  M.2 Key M  [TE_M2_KEYM_2199230]
J10  HC-1.25-2PLT  [CONN-SMD_HC-1.25-2PLT]
L1  1uH  [GEN_L_1210]
R2  0  [GEN_R_0402]
R4  0  [GEN_R_0402]
R14  0.01  [GEN_R_0603]
R24  49.9  [GEN_R_0402]
R27  0  [GEN_R_0402]
R28  0  [GEN_R_0402]
R31  0  [GEN_R_0402]
R32  0  [GEN_R_0402]
R35  0  [GEN_R_0402]
R36  0  [GEN_R_0402]
R39  0  [GEN_R_0402]
R40  0  [GEN_R_0402]
R54  0.01  [GEN_R_0603]
R72  10K  [GEN_R_0402]
R82  10K  [GEN_R_0402]
R109  280K  [GEN_R_0402]
R110  35.7k  [GEN_R_0402]
SO1  2.5mm M2 SMT Standoff  [STANDOFF_M2_9774025243R]
SO2  2.5mm M2 SMT Standoff  [STANDOFF_M2_9774025243R]
SO3  2.5mm M2 SMT Standoff  [STANDOFF_M2_9774025243R]
SO4  2.5mm M2 SMT Standoff  [STANDOFF_M2_9774025243R]
TP21  PCB  [GEN_TP_PCB]  (value not drawn)
TP22  PCB  [GEN_TP_PCB]  (value not drawn)
U17  TPS61023  [TI_SOT563_DRL0006A]

### Ports
MGT_CLK1_N_USB (bidir), MGT_CLK1_P_USB (bidir), PERST# (bidir), REFINOUT (bidir), SYNC (bidir), VARIANT (bidir), {MGT_RX} (out, harness MGT_RX), {MGT_TX} (in, harness MGT_TX)

### Harnesses
MGT_RX: 0, 1, 2, 3, 4, 5, 6, 7
MGT_TX: 0, 1, 2, 3, 4, 5, 6, 7

### Nets
+3V3: R82.1
+5V3: C100.2 C101.2 C102.1 C128.2 R109.2 U17.6(VOUT)
+VUSB: #FLG026.1 J10.1 R14.1 R54.2 TP21.1
GND: C99.1 C101.1 C102.2 C127.2 C128.1 D2.2(A) D3.2(A) J1.2(SHIELD) J2.2(SHIELD) J8.2 J8.4 J8.10 J8.16 J8.22 J8.28 J8.34 J8.40 J8.46 J8.52 J8.58 J8.70 J8.72 J8.74 J8.76 J8.77 J10.2 J10.3 J10.4 R110.2 SO1.1 SO2.1 SO3.1 SO4.1 U17.4(GND)
+VUSB_M2: J8.3 J8.5 J8.13 J8.15 J8.17 J8.19 J8.69 J8.71 J8.73 R54.1
+VUSB_R: #FLG019.1 C99.2 C127.1 L1.1 R14.2 R72.2 TP22.1 U17.3(VIN)
M2_PER0_N: C42.1 J8.42
M2_PER0_P: C43.1 J8.44
M2_PER1_N: C38.1 J8.30
M2_PER1_P: C39.1 J8.32
M2_PER2_N: C34.1 J8.18
M2_PER2_P: C35.1 J8.20
M2_PER3_N: C30.1 J8.6
M2_PER3_P: C31.1 J8.8
M2_PERST#: J8.49 R24.2
M2_PET0_N: J8.48 R39.2
M2_PET0_P: J8.50 R40.2
M2_PET1_N: J8.36 R35.2
M2_PET1_P: J8.38 R36.2
M2_PET2_N: J8.24 R31.2
M2_PET2_P: J8.26 R32.2
M2_PET3_N: J8.12 R27.2
M2_PET3_P: J8.14 R28.2
M2_REFCLK_N: C46.1 J8.54
M2_REFCLK_P: C47.1 J8.56
MGT_CLK1_N: C46.2 ; port MGT_CLK1_N_USB
MGT_CLK1_P: C47.2 ; port MGT_CLK1_P_USB
MGT_RX0_N: R27.1 ; port {MGT_RX}.0
MGT_RX0_P: R28.1 ; port {MGT_RX}.1
MGT_RX1_N: R31.1 ; port {MGT_RX}.2
MGT_RX1_P: R32.1 ; port {MGT_RX}.3
MGT_RX2_N: R35.1 ; port {MGT_RX}.4
MGT_RX2_P: R36.1 ; port {MGT_RX}.5
MGT_RX3_N: R39.1 ; port {MGT_RX}.6
MGT_RX3_P: R40.1 ; port {MGT_RX}.7
MGT_TX0_N: C30.2 ; port {MGT_TX}.0
MGT_TX0_P: C31.2 ; port {MGT_TX}.1
MGT_TX1_N: C34.2 ; port {MGT_TX}.2
MGT_TX1_P: C35.2 ; port {MGT_TX}.3
MGT_TX2_N: C38.2 ; port {MGT_TX}.4
MGT_TX2_P: C39.2 ; port {MGT_TX}.5
MGT_TX3_N: C42.2 ; port {MGT_TX}.6
MGT_TX3_P: C43.2 ; port {MGT_TX}.7
PERST#: R24.1 ; port PERST#
REFINOUT: R4.1 ; port REFINOUT
REFINOUT1: D2.1(K) J1.1(Signal) R4.2
SYNC: R2.1 ; port SYNC
SYNC1: D3.1(K) J2.1(Signal) R2.2
VARIANT: R82.2 ; port VARIANT
NetC100_1: C100.1 R109.1 R110.1 U17.1(FB)
NetL1_2: L1.2 U17.5(SW)
NetR72_1: R72.1 U17.2(EN)

Not connected (* = marked no-connect by the designer): J8 1* 7* 9* 11* 21* 23* 25* 27* 29* 31* 33* 35* 37* 39* 41* 43* 45* 47* 51* 53* 55* 57* 67* 68* 75*

### Layout directives
differential pair; differential pair class PCIe: M2_PER0_N, M2_PER0_P, M2_PER1_N, M2_PER1_P, M2_PER2_N, M2_PER2_P, M2_PER3_N, M2_PER3_P, M2_PET0_N, M2_PET0_P, M2_PET1_N, M2_PET1_P, M2_PET2_N, M2_PET2_P, M2_PET3_N, M2_PET3_P, M2_REFCLK_N, M2_REFCLK_P, MGT_CLK1_N, MGT_CLK1_P, MGT_RX0_N, MGT_RX0_P, MGT_RX1_N, MGT_RX1_P, MGT_RX2_N, MGT_RX2_P, MGT_RX3_N, MGT_RX3_P, MGT_TX0_N, MGT_TX0_P, MGT_TX1_N, MGT_TX1_P, MGT_TX2_N, MGT_TX2_P, MGT_TX3_N, MGT_TX3_P

### Notes on the sheet
- M.2 Key M Connector - Custom Pinout
- Probe Comp
- Fan Connector
- Ground Lug
- Variant Pin Strap
- Refclock and Sync BNCs
- (near R24) AC Couple PER Lines with 220nF
- (near R24) AC Couple REFCLK Lines with 100nF
- 5V3 Boost Converter
- NOTE: The TB/USB4 adaptor must be modified to give us VUSB instead of 3V3
- Vout = (280/35.7+1)*0.6 = 5.31V
- (near R110) 5V3: 1.05A pre-config, 0.807A post-config
- Interposer Standoffs
- 1
- 2
- 3
- 4
- 5
- 6
- A
- B
- C
- Aleksa Bjelogrlic
- D
- Title: ThunderScope
- File: M2_KEY_M.kicad_sch
- Sheet: /
- EEVengers
- KiCad E.D.A.  kicad (5.1.4)-1
- Size: A4
- Date:
- Rev: 5.3
- Id: 1/1

### Library data of the parts
C30 C31 C34 C35 C38 C39 C42 C43 = CAP 220nF 16V X7R 0402: HOUSE PART NUMBER: C-100nF-0402-002; MANUFACTURER: Murata; MANUFACTURER PART NUMBER: GCM155R71C224KE02D; VOLTAGE RATING: 16V; Substitutions Policy: Any Parametric Equivalent; PACKAGE: 0402; SUPPLIER 1: Mouser; SUPPLIER PART NUMBER 1: 81-GCM155R71C224KE2D; Footprint: Thunderscope_Rev5:GEN_C_0402; Value: 220nF
C46 C47 = CAP 100nF 16V X7R 0402: as C185 on sheet FPGA_VREG; PACKAGE: 0402; SUPPLIER 1: Mouser; SUPPLIER PART NUMBER 1: 81-GCM155R71C104KA5D; Footprint: Thunderscope_Rev5:GEN_C_0402; Value: 100nF
C99 C101 C128 = CAP 22uF 25V X5R 0805: as C75 on sheet FPGA_VREG; PACKAGE: 0805; SUPPLIER 1: Mouser; SUPPLIER PART NUMBER 1: 81-GRM21BR61E226ME4L; Footprint: Thunderscope_Rev5:GEN_C_0805; Value: 22uF
C100 = CAP 18pF 50V C0G 0402: MANUFACTURER: KEMET; MANUFACTURER PART NUMBER: CBR04C180F5GAC; VOLTAGE RATING: 50V; TEMPERATURE COEFFICIENT: C0G; Substitutions Policy: No Substitutions; PACKAGE: 0402; SUPPLIER 1: Mouser; SUPPLIER PART NUMBER 1: 80-CBR04C180F5G; Footprint: Thunderscope_Rev5:GEN_C_0402; Value: 18pF
C102 C127 = CAP 1uF 25V X5R 0402: MANUFACTURER: Murata; MANUFACTURER PART NUMBER: GRM155R61E105KA12D; VOLTAGE RATING: 25V; Substitutions Policy: Any Parametric Equivalent; PACKAGE: 0402; SUPPLIER 1: Mouser; SUPPLIER PART NUMBER 1: 81-GRM155R61E105KA2D; Footprint: Thunderscope_Rev5:GEN_C_0402; Value: 1uF
D2 D3 = TVS TPD1E1B04: MANUFACTURER: Texas Instruments; MANUFACTURER PART NUMBER: TPD1E1B04DPYR; Substitutions Policy: No Substitutions; SUPPLIER 1: Texas Instruments; SUPPLIER PART NUMBER 1: TPD1E1B04DPYR; PACKAGE: 2-X1SON (1x0.6mm); Footprint: Thunderscope_Rev5:TI_X1SON_DPY0002A; Value: TPD1E1B04
J1 J2 = BNC JACK R/A: MANUFACTURER: Molex; MANUFACTURER PART NUMBER: 73100-0105; Substitutions Policy: No Substitutions; SUPPLIER 1: Mouser; SUPPLIER PART NUMBER 1: 538-73100-0105; PACKAGE: Through Hole; Footprint: Thunderscope_Rev5:MOL_0731000105; Value: BNC
J8 = CONN M.2 Key M FEMALE: MANUFACTURER: TE Connectivity; MANUFACTURER PART NUMBER: 1-2199230-5; Substitutions Policy: No Substitutions; SUPPLIER 1: Mouser; SUPPLIER PART NUMBER 1: 571-1-2199230-5; PACKAGE: Surface Mount; Footprint: Thunderscope_Rev5:TE_M2_KEYM_2199230; Value: M.2 Key M
J10 = CONN 1.27mm 2PIN: MANUFACTURER: KYOCERA AVX; MANUFACTURER PART NUMBER: 009155002852006; Substitutions Policy: No Substitutions; SUPPLIER 1: Mouser; SUPPLIER PART NUMBER 1: 581-009155002852006; PACKAGE: Surface Mount; Footprint: Thunderscope_Rev5:KYO_009155002852006; Value: HC-1.25-2PLT
L1 = IND 1uH 5.5A 32 MOHM 1210: as L2 on sheet FPGA_VREG; SUPPLIER 1: Mouser; SUPPLIER PART NUMBER 1: 652-SRP3212-1R0M; MANUFACTURER PART NUMBER: SRP3212-1R0M; PACKAGE: 1210; Value: 1uH; Footprint: Thunderscope_Rev5:GEN_L_1210
R2 R4 R27 R28 R31 R32 R35 R36 R39 R40 = RES 0 OHM 1/16W 0402: MANUFACTURER: Yageo; MANUFACTURER PART NUMBER: RC0402JR-070RL; Substitutions Policy: Any Parametric Equivalent; PACKAGE: 0402; SUPPLIER 1: Mouser; SUPPLIER PART NUMBER 1: 603-RC0402JR-070RL; Footprint: Thunderscope_Rev5:GEN_R_0402; Value: 0
R14 R54 = RES 0.01 OHM 1% 1/4W 0603: as R57 on sheet FPGA_VREG; SUPPLIER 1: Mouser; SUPPLIER PART NUMBER 1: 754-RL0816T-R010-F; PACKAGE: 0603; Footprint: Thunderscope_Rev5:GEN_R_0603; Value: 0.01
R24 = RES 49.9 OHM 1% 1/10W 0402: MANUFACTURER: Yageo; MANUFACTURER PART NUMBER: RC0402FR-0749R9L; TOLERANCE: 1%; Substitutions Policy: Any Parametric Equivalent; PACKAGE: 0402; SUPPLIER 1: Mouser; SUPPLIER PART NUMBER 1: 603-RC0402FR-0749R9L; Footprint: Thunderscope_Rev5:GEN_R_0402; Value: 49.9
R72 R82 = RES 10K OHM 1% 1/16W 0402: as R1 on sheet FPGA_VREG; PACKAGE: 0402; SUPPLIER 1: Mouser; SUPPLIER PART NUMBER 1: 603-RC0402FR-0710KL; Footprint: Thunderscope_Rev5:GEN_R_0402; Value: 10K
R109 = RES 280K OHM 1% 1/16W 0402: MANUFACTURER: Yageo; MANUFACTURER PART NUMBER: RC0402FR-07280KL; TOLERANCE: 1%; Substitutions Policy: Any Parametric Equivalent; PACKAGE: 0402; SUPPLIER 1: Mouser; SUPPLIER PART NUMBER 1: 603-RC0402FR-07280KL; Footprint: Thunderscope_Rev5:GEN_R_0402; Value: 280K
R110 = RES 35.7K OHM 1% 1/16W 0402: MANUFACTURER: Yageo; MANUFACTURER PART NUMBER: RC0402FR-0735K7L; TOLERANCE: 1%; Substitutions Policy: Any Parametric Equivalent; PACKAGE: 0402; SUPPLIER 1: Mouser; SUPPLIER PART NUMBER 1: 603-RC0402FR-0735K7L; Footprint: Thunderscope_Rev5:GEN_R_0402; Value: 35.7k
SO1-SO4 = STANDOFF_M2_9774025243R: MANUFACTURER: Wurth Elektronik; Substitutions Policy: No Substitutions; SUPPLIER 1: Mouser; SUPPLIER PART NUMBER 1: 710-9774025243R; MANUFACTURER PART NUMBER: 9774025243R; PACKAGE: Surface Mount; Footprint: Thunderscope_Rev5:STANDOFF_M2_9774025243R; Value: 2.5mm M2 SMT Standoff
TP21 TP22 = TP PCB 1mm: Footprint: Thunderscope_Rev5:GEN_TP_PCB; Value: PCB
U17 = IC BOOST TPS61023: MANUFACTURER: Texas Instruments; MANUFACTURER PART NUMBER: TPS61023DRLT; Substitutions Policy: No Substitutions; SUPPLIER 1: Texas Instruments; SUPPLIER PART NUMBER 1: TPS61023DRLT; PACKAGE: SOT-563; Footprint: Thunderscope_Rev5:TI_SOT563_DRL0006A; Value: TPS61023
#FLG019 #FLG026 = PWR_FLAG: Value: PWR_FLAG

## Sheet PLL.SchDoc
size 297 x 209 mm
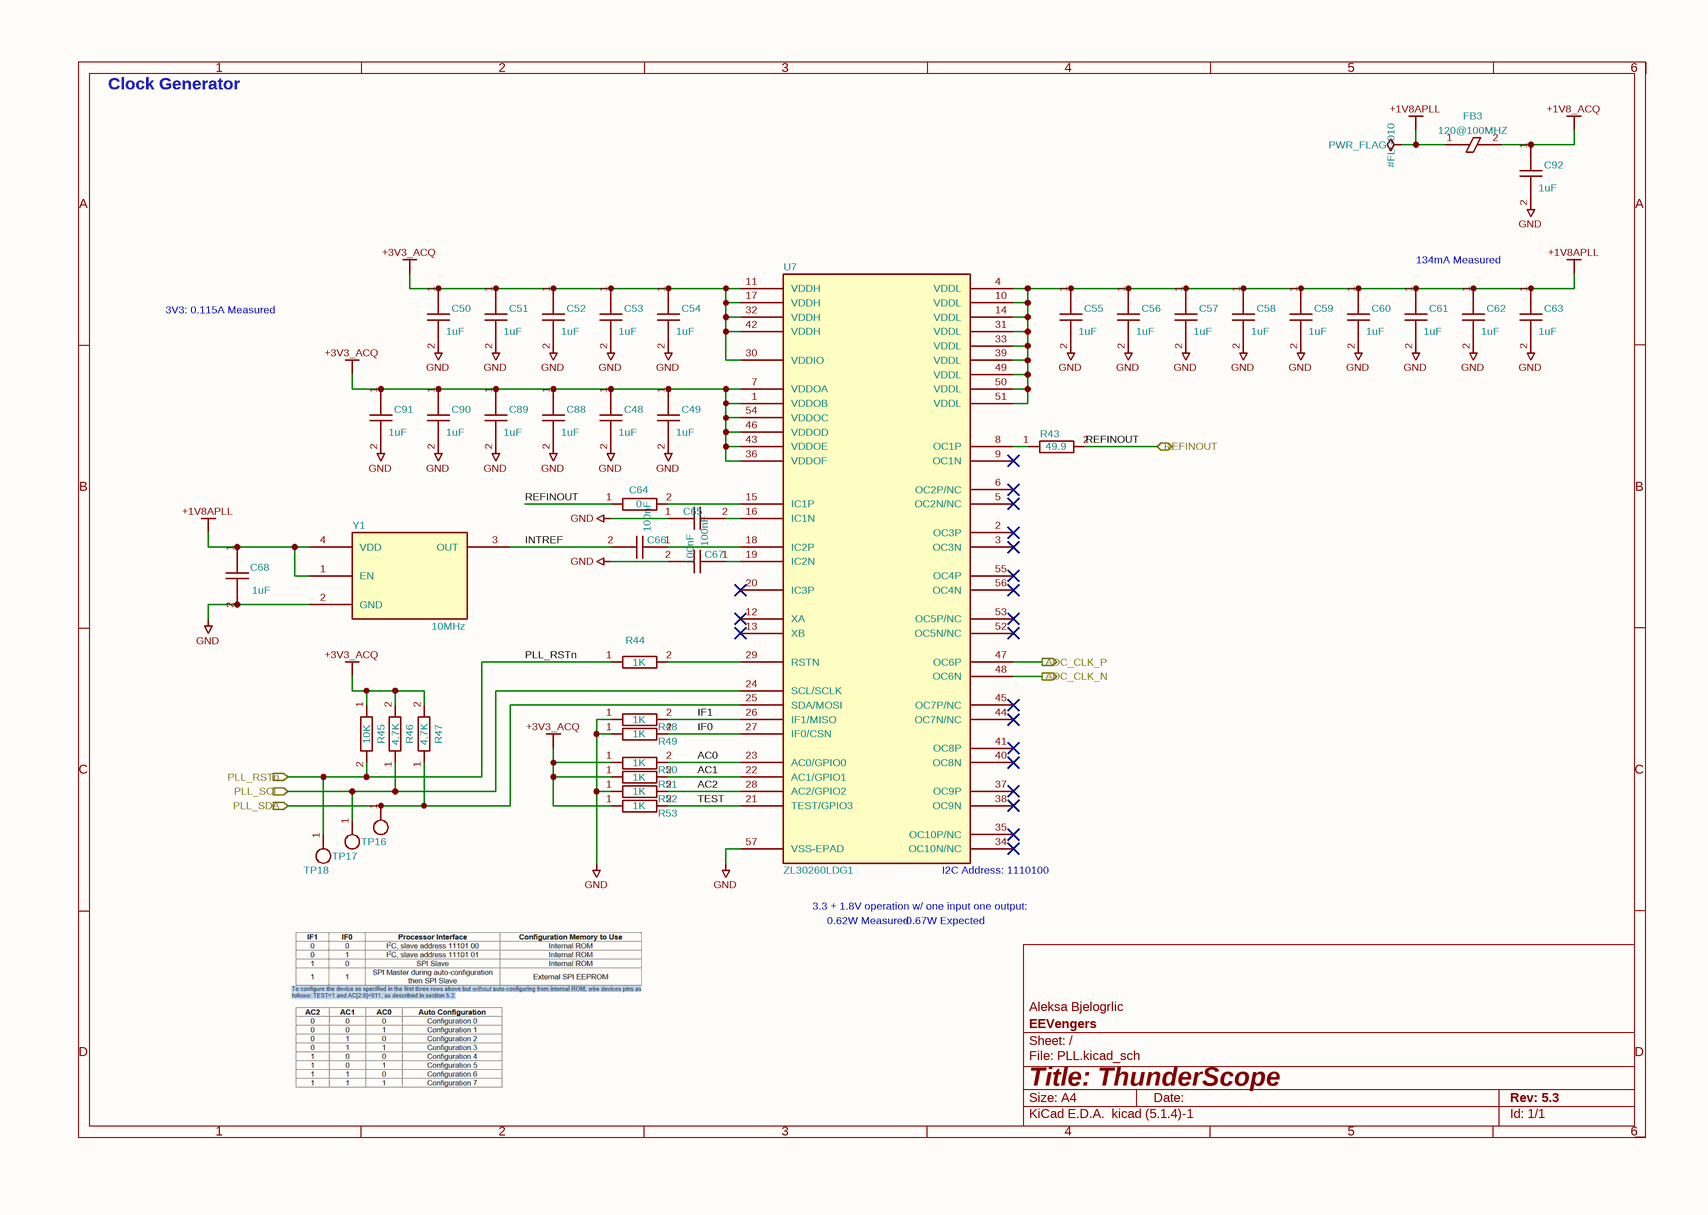
[diagram p9: PLL.SchDoc]

### Parts
#FLG010  PWR_FLAG  (graphical)
C48  1uF  [GEN_C_0402]
C49  1uF  [GEN_C_0402]
C50  1uF  [GEN_C_0402]
C51  1uF  [GEN_C_0402]
C52  1uF  [GEN_C_0402]
C53  1uF  [GEN_C_0402]
C54  1uF  [GEN_C_0402]
C55  1uF  [GEN_C_0402]
C56  1uF  [GEN_C_0402]
C57  1uF  [GEN_C_0402]
C58  1uF  [GEN_C_0402]
C59  1uF  [GEN_C_0402]
C60  1uF  [GEN_C_0402]
C61  1uF  [GEN_C_0402]
C62  1uF  [GEN_C_0402]
C63  1uF  [GEN_C_0402]
C64  0  [GEN_R_0402]
C65  100nF  [GEN_C_0402]
C66  100nF  [GEN_C_0402]
C67  100nF  [GEN_C_0402]
C68  1uF  [GEN_C_0402]
C88  1uF  [GEN_C_0402]
C89  1uF  [GEN_C_0402]
C90  1uF  [GEN_C_0402]
C91  1uF  [GEN_C_0402]
C92  1uF  [GEN_C_0402]
FB3  120@100MHZ  [GEN_R_0402]
R43  49.9  [GEN_R_0402]
R44  1K  [GEN_R_0402]
R45  10K  [GEN_R_0402]
R46  4.7K  [GEN_R_0402]
R47  4.7K  [GEN_R_0402]
R48  1K  [GEN_R_0402]
R49  1K  [GEN_R_0402]
R50  1K  [GEN_R_0402]
R51  1K  [GEN_R_0402]
R52  1K  [GEN_R_0402]
R53  1K  [GEN_R_0402]
TP16  PCB  [GEN_TP_PCB]  (value not drawn)
TP17  PCB  [GEN_TP_PCB]  (value not drawn)
TP18  PCB  [GEN_TP_PCB]  (value not drawn)
U7  ZL30260LDG1  [MC_QFN56_ZL30260]
Y1  10MHz  [ECS_TXO-3225]

### Ports
ADC_CLK_N (out), ADC_CLK_P (out), PLL_RSTn (in), PLL_SCL (in), PLL_SDA (in), REFINOUT (bidir)

### Nets
+1V8_ACQ: C92.1 FB3.2
+1V8APLL: #FLG010.1 C55.1 C56.1 C57.1 C58.1 C59.1 C60.1 C61.1 C62.1 C63.1 C68.1 FB3.1 U7.4(VDDL) U7.10(VDDL) U7.14(VDDL) U7.31(VDDL) U7.33(VDDL) U7.39(VDDL) U7.49(VDDL) U7.50(VDDL) U7.51(VDDL) Y1.1(EN) Y1.4(VDD)
+3V3_ACQ: C48.1 C49.1 C50.1 C51.1 C52.1 C53.1 C54.1 C88.1 C89.1 C90.1 C91.1 R45.1 R46.2 R47.2 R50.1 R51.1 R53.1 U7.1(VDDOB) U7.7(VDDOA) U7.11(VDDH) U7.17(VDDH) U7.30(VDDIO) U7.32(VDDH) U7.36(VDDOF) U7.42(VDDH) U7.43(VDDOE) U7.46(VDDOD) U7.54(VDDOC)
GND: C48.2 C49.2 C50.2 C51.2 C52.2 C53.2 C54.2 C55.2 C56.2 C57.2 C58.2 C59.2 C60.2 C61.2 C62.2 C63.2 C65.1 C67.2 C68.2 C88.2 C89.2 C90.2 C91.2 C92.2 R48.1 R49.1 R52.1 U7.57(VSS-EPAD) Y1.2(GND)
AC0: R50.2 U7.23(AC0/GPIO0)
AC1: R51.2 U7.22(AC1/GPIO1)
AC2: R52.2 U7.28(AC2/GPIO2)
ADC_CLK_N: U7.48(OC6N) ; port ADC_CLK_N
ADC_CLK_P: U7.47(OC6P) ; port ADC_CLK_P
IF0: R49.2 U7.27(IF0/CSN)
IF1: R48.2 U7.26(IF1/MISO)
INTREF: C66.2 Y1.3(OUT)
PLL_RSTn: R44.1 R45.2 TP18.1 ; port PLL_RSTn
PLL_SCL: R46.1 TP17.1 U7.24(SCL/SCLK) ; port PLL_SCL
PLL_SDA: R47.1 TP16.1 U7.25(SDA/MOSI) ; port PLL_SDA
REFINOUT: C64.1 R43.2 ; port REFINOUT
TEST: R53.2 U7.21(TEST/GPIO3)
NetC64_2: C64.2 U7.15(IC1P)
NetC65_2: C65.2 U7.16(IC1N)
NetC66_1: C66.1 U7.18(IC2P)
NetC67_1: C67.1 U7.19(IC2N)
NetR43_1: R43.1 U7.8(OC1P)
NetR44_2: R44.2 U7.29(RSTN)

Not connected (* = marked no-connect by the designer): U7 2(OC3P)* 3(OC3N)* 5(OC2N/NC)* 6(OC2P/NC)* 9(OC1N)* 12(XA)* 13(XB)* 20(IC3P)* 34(OC10N/NC)* 35(OC10P/NC)* 37(OC9P)* 38(OC9N)* 40(OC8N)* 41(OC8P)* 44(OC7N/NC)* 45(OC7P/NC)* 52(OC5N/NC)* 53(OC5P/NC)* 55(OC4P)* 56(OC4N)*

### Notes on the sheet
- Clock Generator
- 134mA Measured
- 3V3: 0.115A Measured
- (near U7) 3.3 + 1.8V operation w/ one input one output:
- 0.62W Measured
- 0.67W Expected
- (near U7) I2C Address: 1110100
- 1
- 2
- 3
- 4
- 5
- 6
- A
- B
- C
- Aleksa Bjelogrlic
- D
- Title: ThunderScope
- File: PLL.kicad_sch
- Sheet: /
- EEVengers
- KiCad E.D.A.  kicad (5.1.4)-1
- Size: A4
- Date:
- Rev: 5.3
- Id: 1/1

### Library data of the parts
C48-C63 C68 C88-C92 = CAP 1uF 25V X5R 0402: as C102 on sheet M2_KEY_M; PACKAGE: 0402; SUPPLIER 1: Mouser; SUPPLIER PART NUMBER 1: 81-GRM155R61E105KA2D; Footprint: Thunderscope_Rev5:GEN_C_0402; Value: 1uF
C64 = RES 0 OHM 1/16W 0402: as R2 on sheet M2_KEY_M; PACKAGE: 0402; SUPPLIER 1: Mouser; SUPPLIER PART NUMBER 1: 603-RC0402JR-070RL; Footprint: Thunderscope_Rev5:GEN_R_0402; Value: 0
C65-C67 = CAP 100nF 16V X7R 0402: as C185 on sheet FPGA_VREG; PACKAGE: 0402; SUPPLIER 1: Mouser; SUPPLIER PART NUMBER 1: 81-GCM155R71C104KA5D; Footprint: Thunderscope_Rev5:GEN_C_0402; Value: 100nF
FB3 = FERRITE BEAD 120 OHM 0402: as FB11 on sheet FPGA_CFG_MGT; SUPPLIER 1: Mouser; SUPPLIER PART NUMBER 1: 81-BLM15PX121SN1D; MANUFACTURER PART NUMBER: BLM15PX121SN1D; PACKAGE: 0402; Footprint: Thunderscope_Rev5:GEN_R_0402; Value: 120@100MHZ
R43 = RES 49.9 OHM 1% 1/10W 0402: as R24 on sheet M2_KEY_M; PACKAGE: 0402; SUPPLIER 1: Mouser; SUPPLIER PART NUMBER 1: 603-RC0402FR-0749R9L; Footprint: Thunderscope_Rev5:GEN_R_0402; Value: 49.9
R44 R48-R53 = RES 1K OHM 1% 1/10W 0402: as R125 on sheet FPGA_VREG; PACKAGE: 0402; SUPPLIER 1: Mouser; SUPPLIER PART NUMBER 1: 603-RC0402FR-071KL; Footprint: Thunderscope_Rev5:GEN_R_0402; Value: 1K
R45 = RES 10K OHM 1% 1/16W 0402: as R1 on sheet FPGA_VREG; PACKAGE: 0402; SUPPLIER 1: Mouser; SUPPLIER PART NUMBER 1: 603-RC0402FR-0710KL; Footprint: Thunderscope_Rev5:GEN_R_0402; Value: 10K
R46 R47 = RES 4.7K OHM 1% 1/16W 0402: as R69 on sheet FPGA_VREG; PACKAGE: 0402; SUPPLIER 1: Mouser; SUPPLIER PART NUMBER 1: 603-RC0402FR-074K7L; Footprint: Thunderscope_Rev5:GEN_R_0402; Value: 4.7K
TP16-TP18 = TP PCB 1mm: Footprint: Thunderscope_Rev5:GEN_TP_PCB; Value: PCB
U7 = IC CLK GEN ZL30260LDG1: MANUFACTURER: Microchip; Substitutions Policy: No Substitutions; MANUFACTURER PART NUMBER: ZL30260LDG1; SUPPLIER 1: Mouser; SUPPLIER PART NUMBER 1: 494-ZL30260LDG1; PACKAGE: 56-VFQFN (8x8mm); Value: ZL30260LDG1; Footprint: Thunderscope_Rev5:MC_QFN56_ZL30260
Y1 = OSC 10MHz ECS-TXO-3225MV: MANUFACTURER: ECS International; MANUFACTURER PART NUMBER: ECS-TXO-3225MV-100-TR; Substitutions Policy: ECO Required for Substitution; SUPPLIER 1: Mouser; SUPPLIER PART NUMBER 1: 520-TXO-3225MV-100-T; PACKAGE: 4-SMD (3.2x2.5mm); Value: 10MHz; Footprint: Thunderscope_Rev5:ECS_TXO-3225
#FLG010 = PWR_FLAG: Value: PWR_FLAG

## Sheet ADC_Driver.SchDoc
size 297 x 209 mm
Used 4 times, as channels ADC Driver 1, ADC Driver 2, ADC Driver 3, ADC Driver 4. Parts and nets are listed once, with the designators drawn on the sheet.
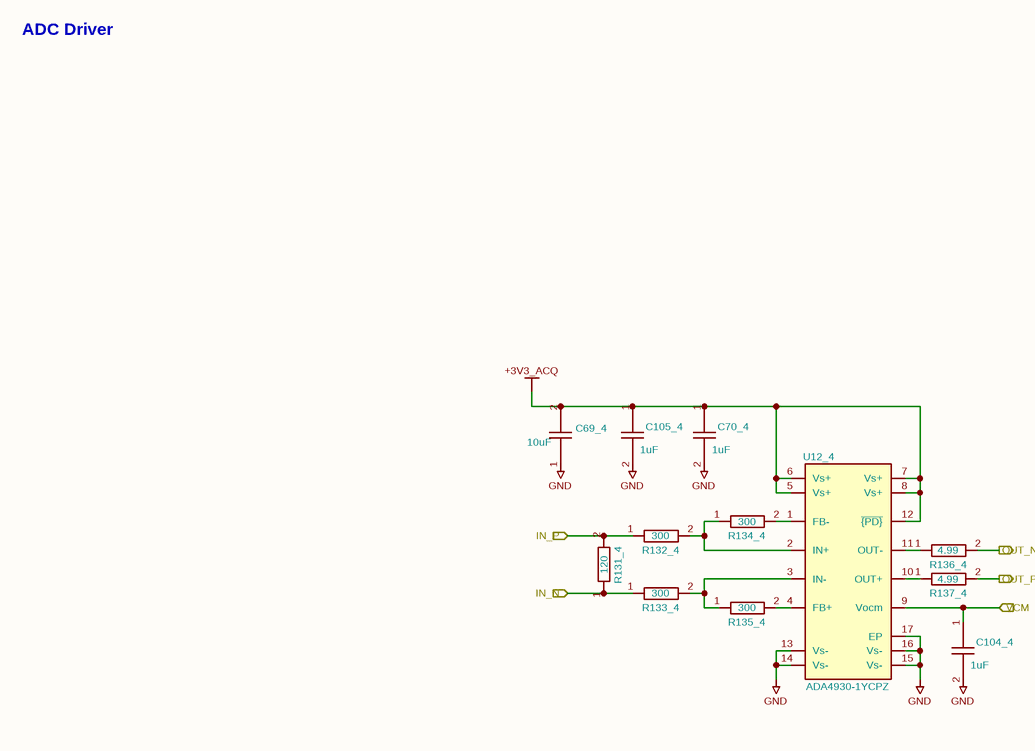
[diagram p10: ADC_Driver.SchDoc]

### Parts
C69_4  10uF  [GEN_C_0603]
C70_4  1uF  [GEN_C_0402]
C104_4  1uF  [GEN_C_0402]
C105_4  1uF  [GEN_C_0402]
R131_4  120  [GEN_R_0402]
R132_4  300  [GEN_R_0402]
R133_4  300  [GEN_R_0402]
R134_4  300  [GEN_R_0402]
R135_4  300  [GEN_R_0402]
R136_4  4.99  [GEN_R_0402]
R137_4  4.99  [GEN_R_0402]
U12_4  ADA4930-1YCPZ  [AD_QFN16_CP-16-21]

### Ports
IN_N (in), IN_P (in), OUT_N (out), OUT_P (out), VCM (in)

### Nets
+3V3_ACQ: C69_4.2 C70_4.1 C105_4.1 U12_4.5(Vs+) U12_4.6(Vs+) U12_4.7(Vs+) U12_4.8(Vs+) U12_4.12(~{{PD}})
GND: C69_4.1 C70_4.2 C104_4.2 C105_4.2 U12_4.13(Vs-) U12_4.14(Vs-) U12_4.15(Vs-) U12_4.16(Vs-) U12_4.17(EP)
IN_N: R131_4.1 R133_4.1 ; port IN_N
IN_P: R131_4.2 R132_4.1 ; port IN_P
OUT_N: R136_4.2 ; port OUT_N
OUT_P: R137_4.2 ; port OUT_P
VCM: C104_4.1 U12_4.9(Vocm) ; port VCM
NetR132_4_2: R132_4.2 R134_4.1 U12_4.2(IN+)
NetR133_4_2: R133_4.2 R135_4.1 U12_4.3(IN-)
NetR134_4_2: R134_4.2 U12_4.1(FB-)
NetR135_4_2: R135_4.2 U12_4.4(FB+)
NetR136_4_1: R136_4.1 U12_4.11(OUT-)
NetR137_4_1: R137_4.1 U12_4.10(OUT+)

### Channels
ADC Driver 1: designators end in _ADC_Driver_1; ports IN_N=CH1_N IN_P=CH1_P OUT_N=IN4_P OUT_P=IN4_N VCM=VCM
ADC Driver 2: designators end in _ADC_Driver_2; ports IN_N=CH2_N IN_P=CH2_P OUT_N=IN3_P OUT_P=IN3_N VCM=VCM
ADC Driver 3: designators end in _ADC_Driver_3; ports IN_N=CH3_N IN_P=CH3_P OUT_N=IN2_P OUT_P=IN2_N VCM=VCM
ADC Driver 4: designators end in _ADC_Driver_4; ports IN_N=CH4_N IN_P=CH4_P OUT_N=IN1_P OUT_P=IN1_N VCM=VCM

### Notes on the sheet
- ADC Driver
- 1
- 2
- 3
- 4
- 5
- 6
- A
- B
- C
- Aleksa Bjelogrlic
- D
- Title: ThunderScope
- File: ADC_Driver.kicad_sch
- Sheet: /
- EEVengers
- KiCad E.D.A.  kicad (5.1.4)-1
- Size: A4
- Date:
- Rev: 5.3
- Id: 1/1

### Library data of the parts
C69_4 = CAP 10uF 25V X5R 0603: as C9 on sheet FPGA_VREG; PACKAGE: 0402; SUPPLIER 1: Mouser; SUPPLIER PART NUMBER 1: 81-GRM188R61E106MA3D; Footprint: Thunderscope_Rev5:GEN_C_0603; Value: 10uF
C70_4 C104_4 C105_4 = CAP 1uF 25V X5R 0402: as C102 on sheet M2_KEY_M; PACKAGE: 0402; SUPPLIER 1: Mouser; SUPPLIER PART NUMBER 1: 81-GRM155R61E105KA2D; Footprint: Thunderscope_Rev5:GEN_C_0402; Value: 1uF
R131_4 = RES 120 OHM 1% 1/16W 0402: MANUFACTURER: Yageo; MANUFACTURER PART NUMBER: RC0402FR-07120RL; TOLERANCE: 1%; Substitutions Policy: Any Parametric Equivalent; PACKAGE: 0402; SUPPLIER 1: Mouser; SUPPLIER PART NUMBER 1: 603-RC0402FR-07120RL; Footprint: Thunderscope_Rev5:GEN_R_0402; Value: 120
R132_4 R133_4 R134_4 R135_4 = RES 300 OHM 0.1% 1/16W 0402: MANUFACTURER: Panasonic; MANUFACTURER PART NUMBER: ERA-2AEB301X; TOLERANCE: 0.1%; Substitutions Policy: ECO Required for Substitution; PACKAGE: 0402; SUPPLIER 1: Mouser; SUPPLIER PART NUMBER 1: 667-ERA-2AEB301X; Footprint: Thunderscope_Rev5:GEN_R_0402; Value: 300
R136_4 R137_4 = RES 4.99 OHM 1% 1/16W 0402: MANUFACTURER: Yageo; MANUFACTURER PART NUMBER: RC0402FR-074R99L; TOLERANCE: 1%; Substitutions Policy: Any Parametric Equivalent; PACKAGE: 0402; SUPPLIER 1: Mouser; SUPPLIER PART NUMBER 1: 603-RC0402FR-074R99L; Footprint: Thunderscope_Rev5:GEN_R_0402; Value: 4.99
U12_4 = IC ADC DRIVER ADA4930-1YCPZ: MANUFACTURER: Analog Devices; MANUFACTURER PART NUMBER: ADA4930-1YCPZ-R7; Substitutions Policy: No Substitutions; SUPPLIER 1: Mouser; SUPPLIER PART NUMBER 1: 584-ADA4930-1YCPZ-R7; PACKAGE: 16-QFN (3x3mm); Footprint: Thunderscope_Rev5:AD_QFN16_CP-16-21; Value: ADA4930-1YCPZ